# EasyEDA Pro project ProPrj_rk3568B2_2026-10-28.epro, schematic Schematic1, sheets 13 to 19 of 19

## Sheets
13 LPDDR4/4X: Create Date: 2026-03-04; Page Name: LPDDR4/4X; Project Name: rk3568B2; Update Date: 2026-03-04
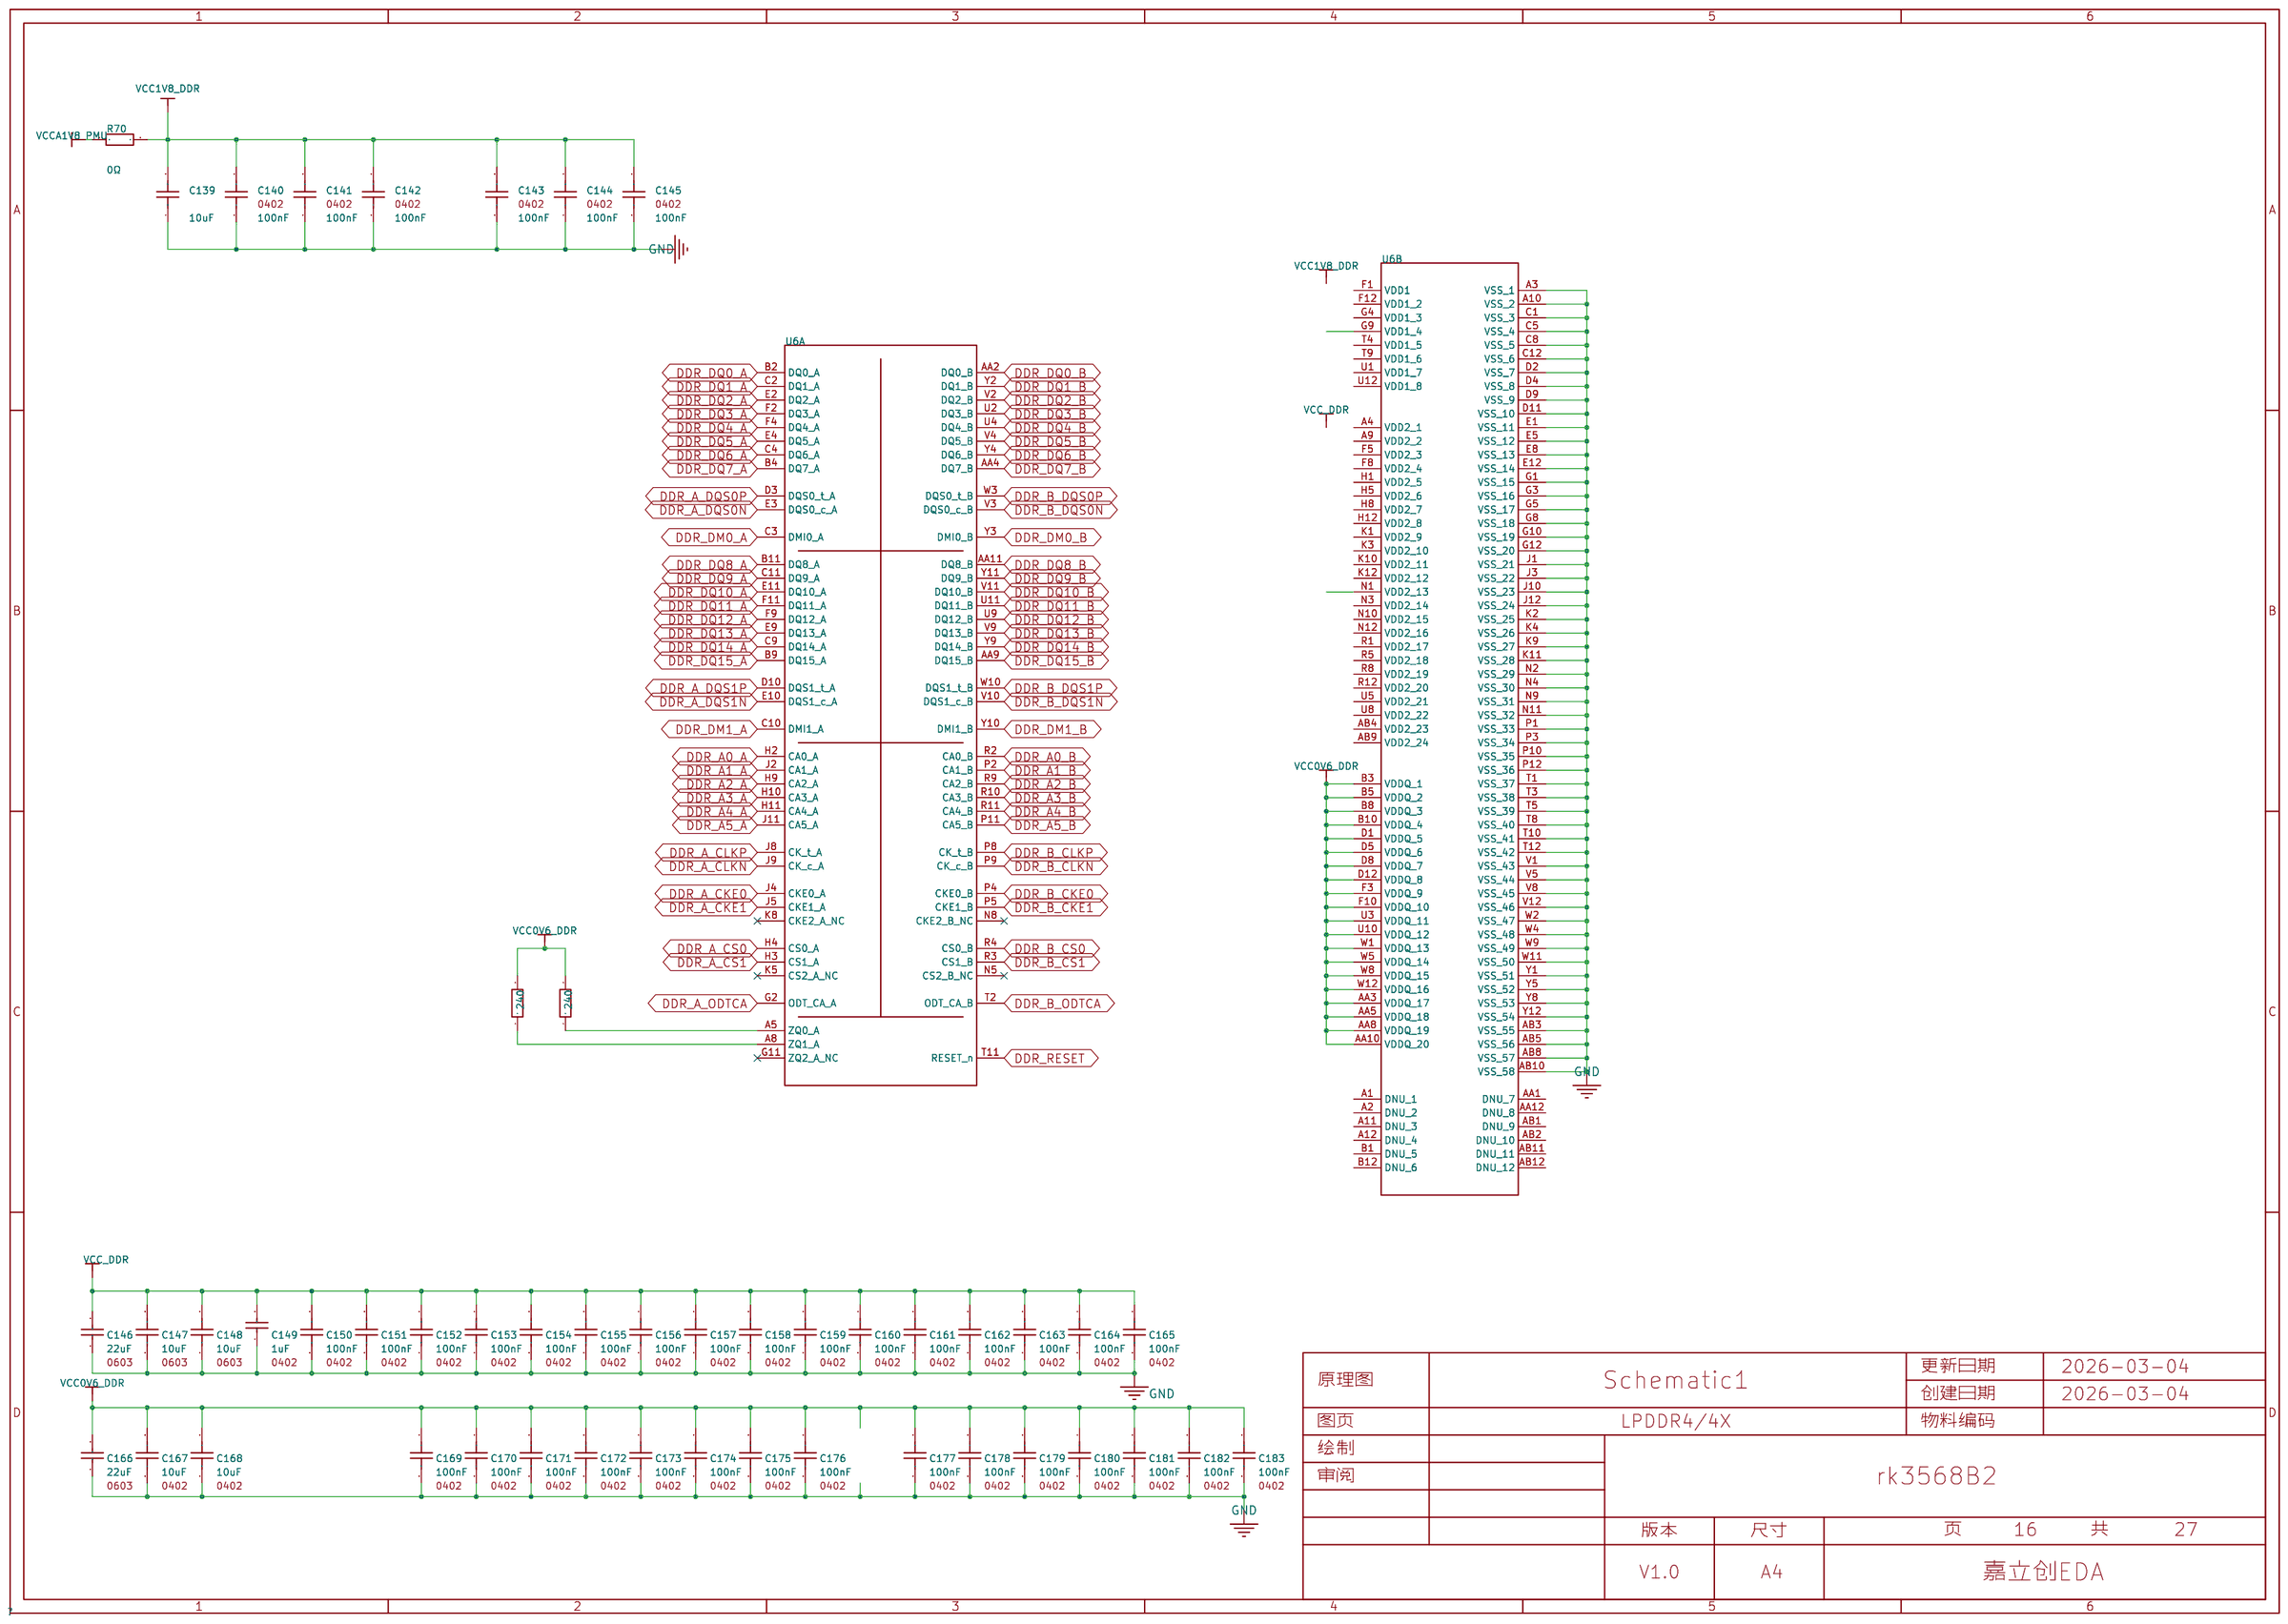
[diagram p12: LPDDR4/4X]
14 RK809-5: Create Date: 2026-03-04; Page Name: RK809-5; Project Name: rk3568B2; Update Date: 2026-03-04
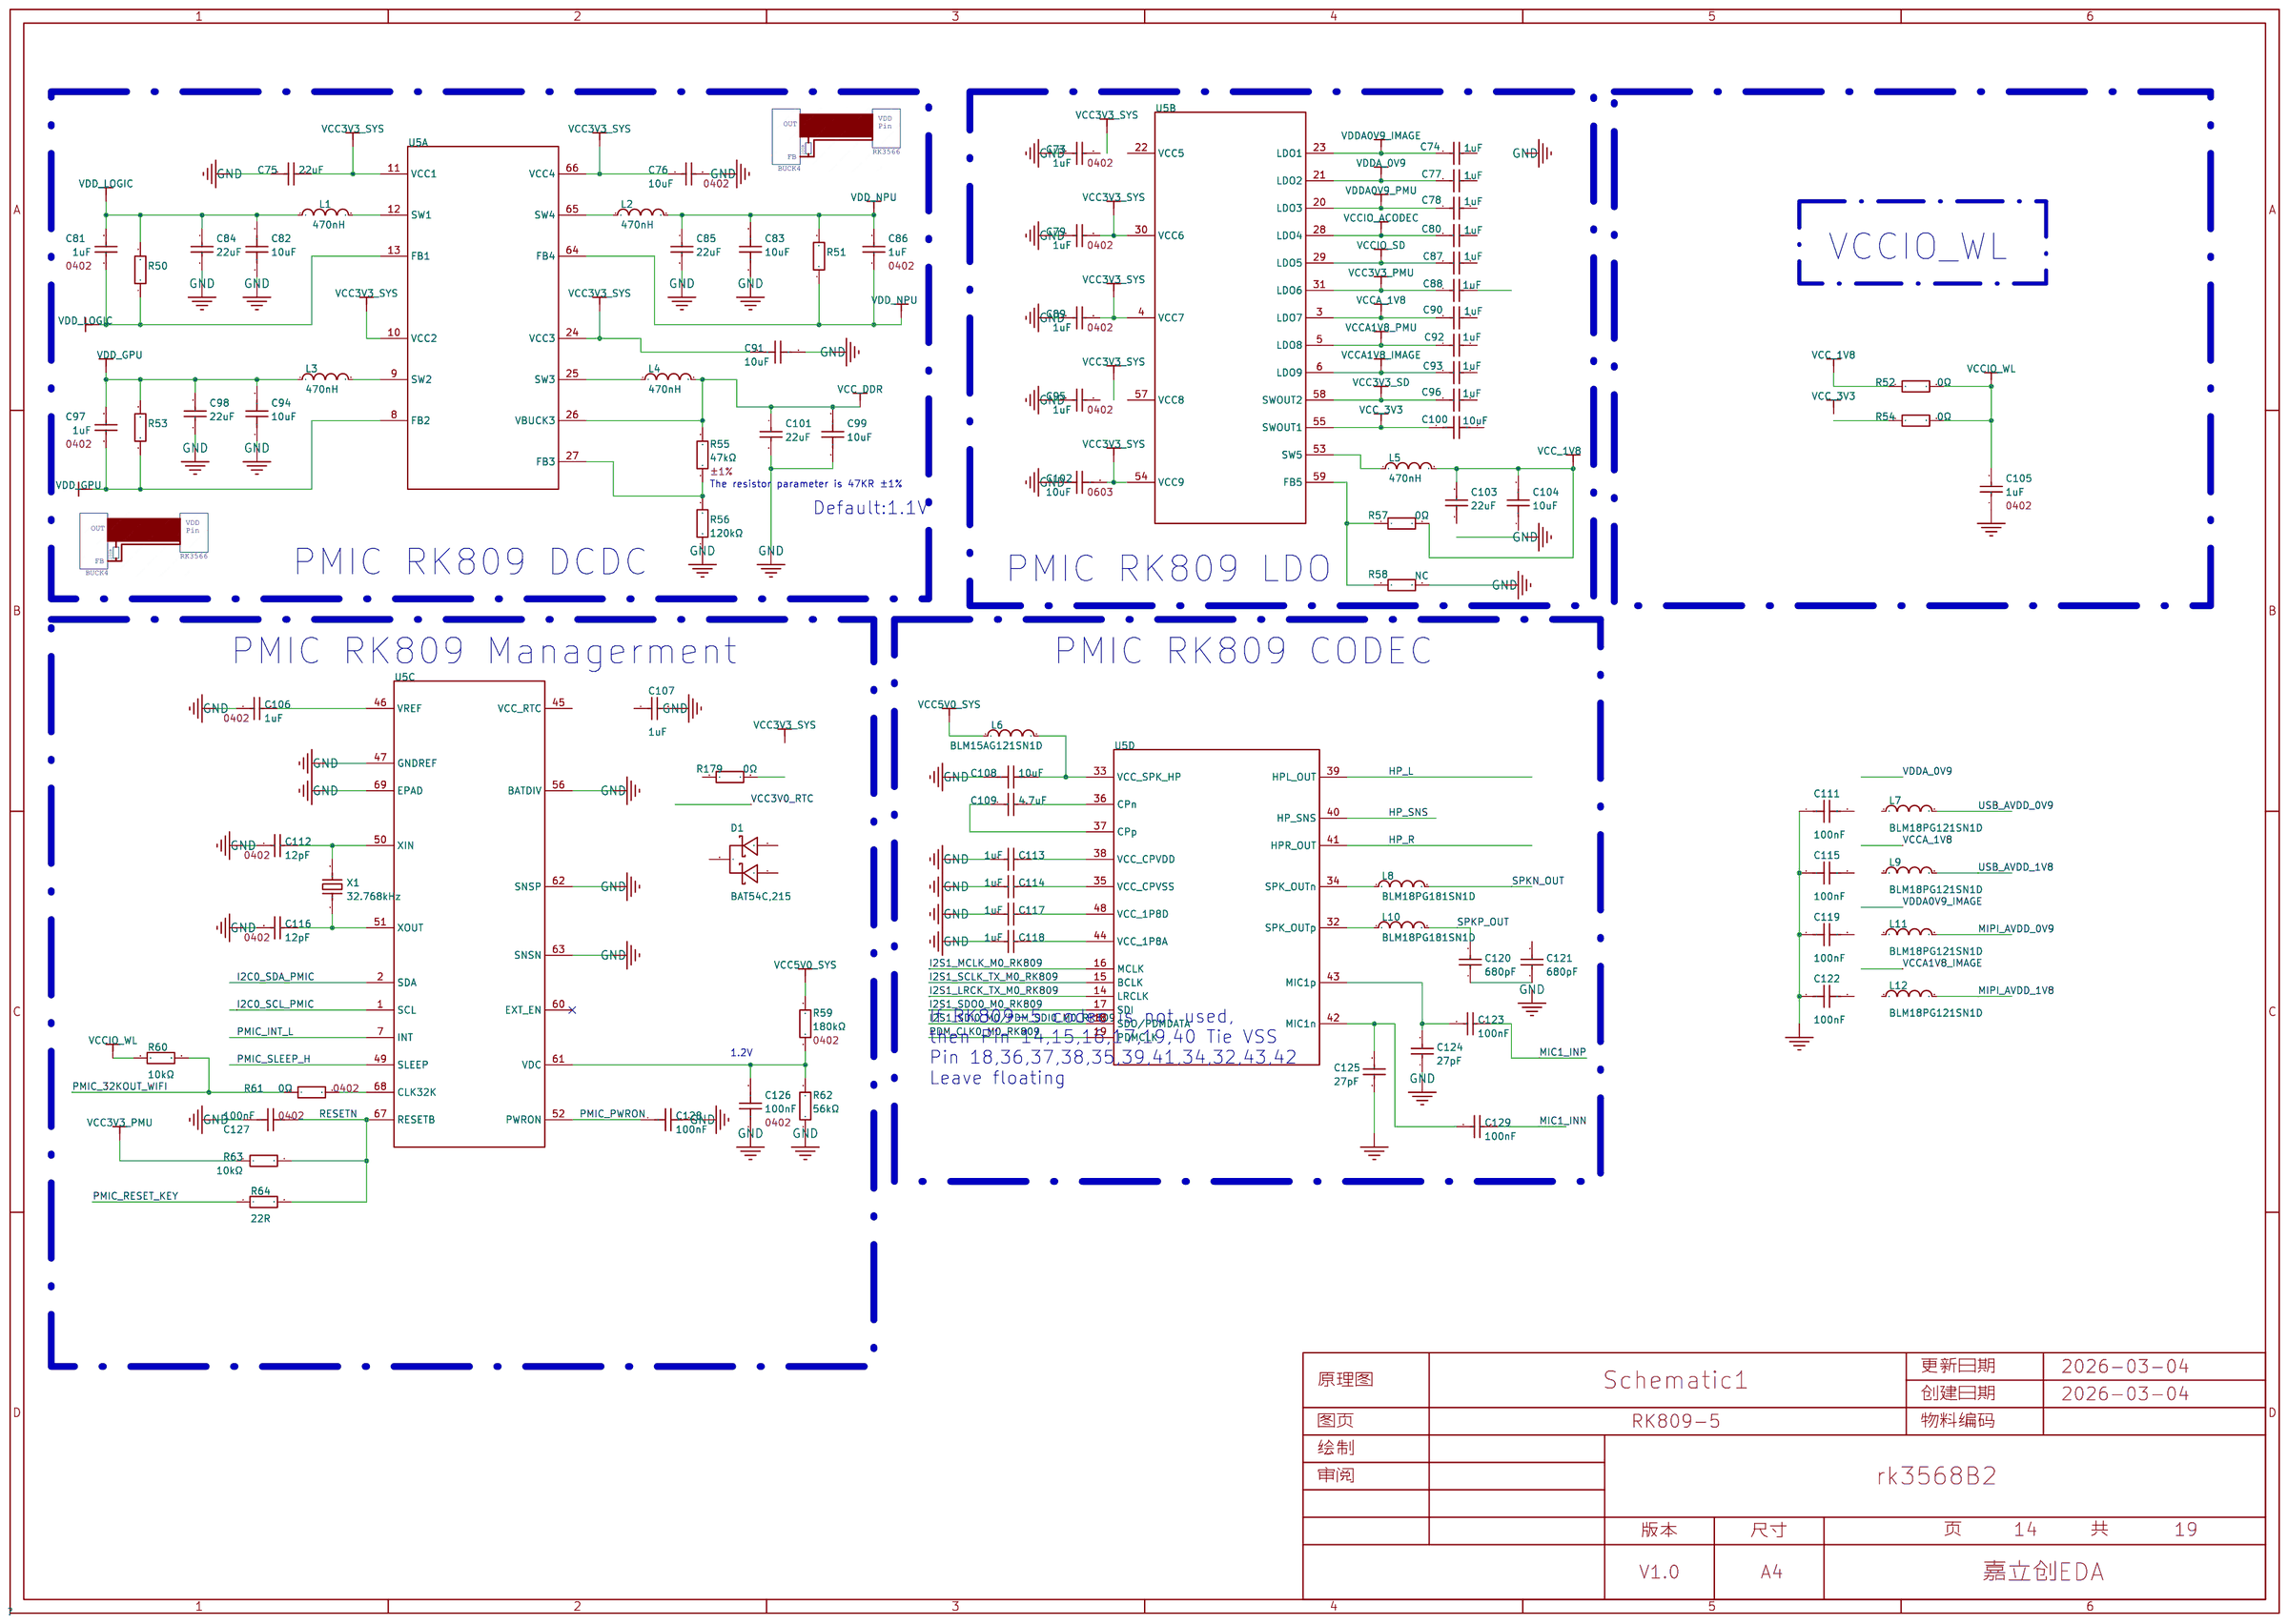
[diagram p13: RK809-5]
15 SOC_FLASH: Board Name: Board1; Page Name: SOC_FLASH; Project Name: RK3568_LPD4X_120P_Core; Update Date: 2025-08-24
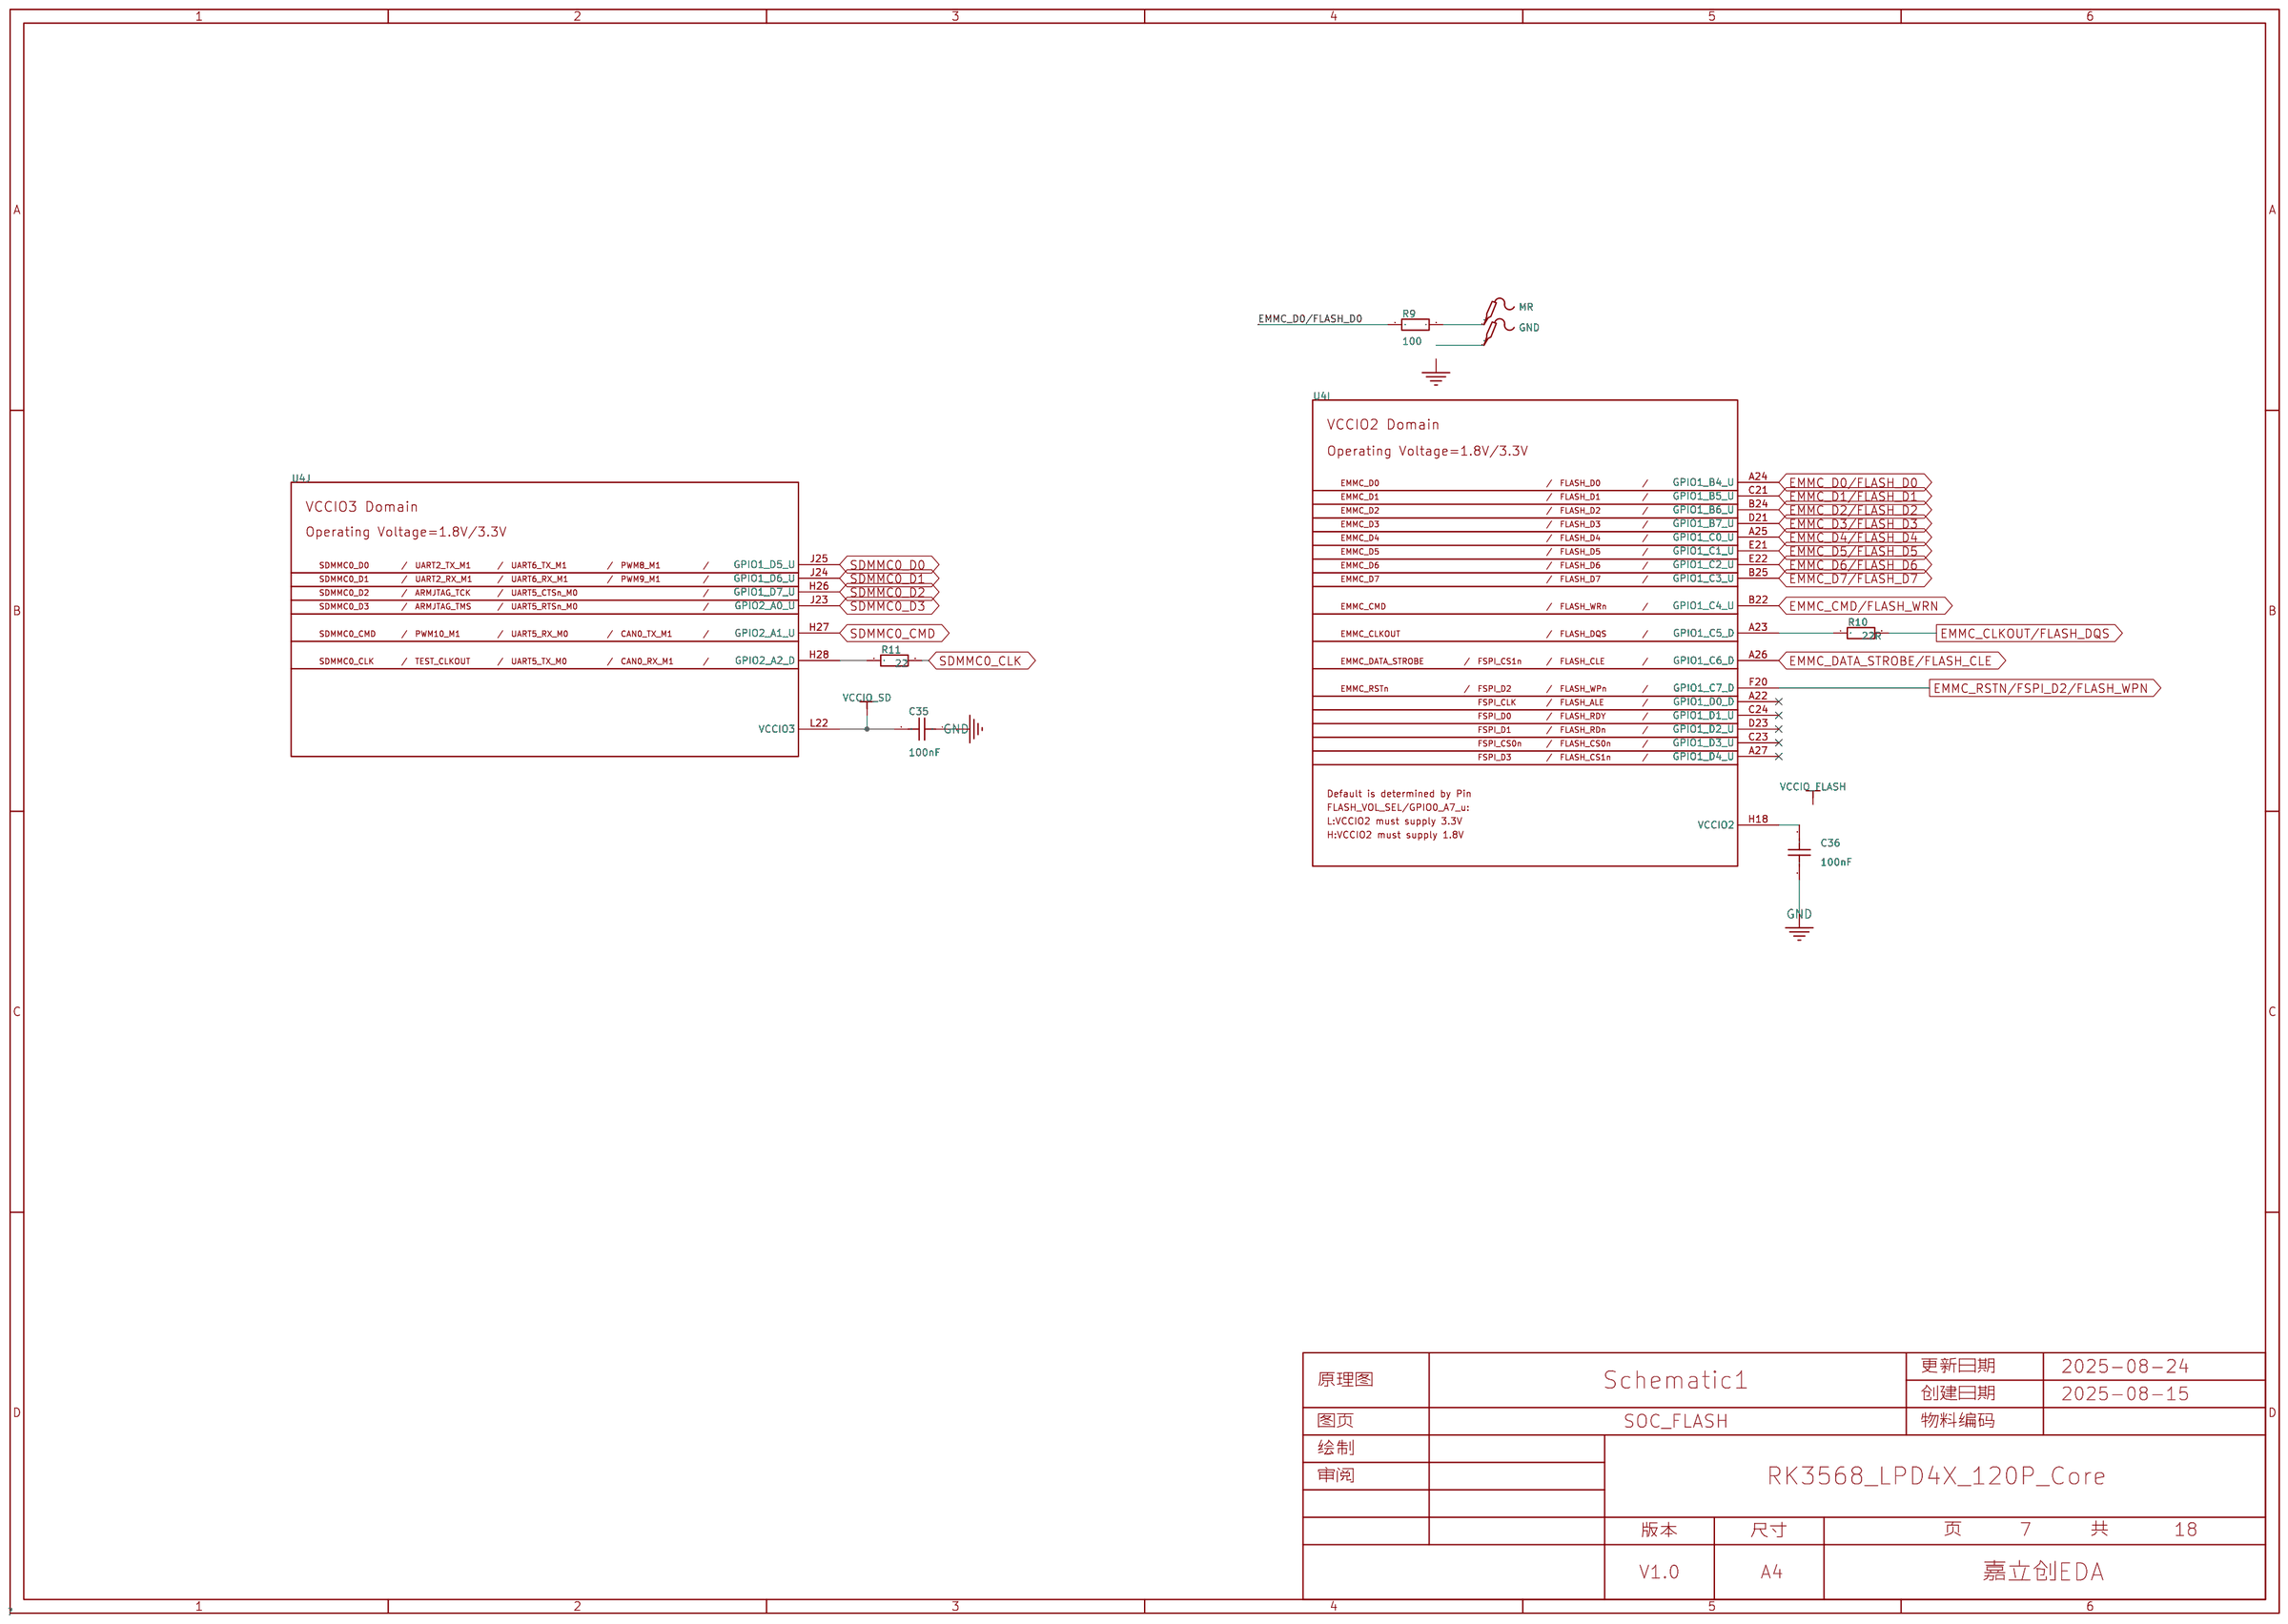
[diagram p14: SOC_FLASH]
16 项目概述: Board Name: Board1; Create Date: 2025-09-28; Page Name: 项目概述; Project Name: Rk3568B路由器
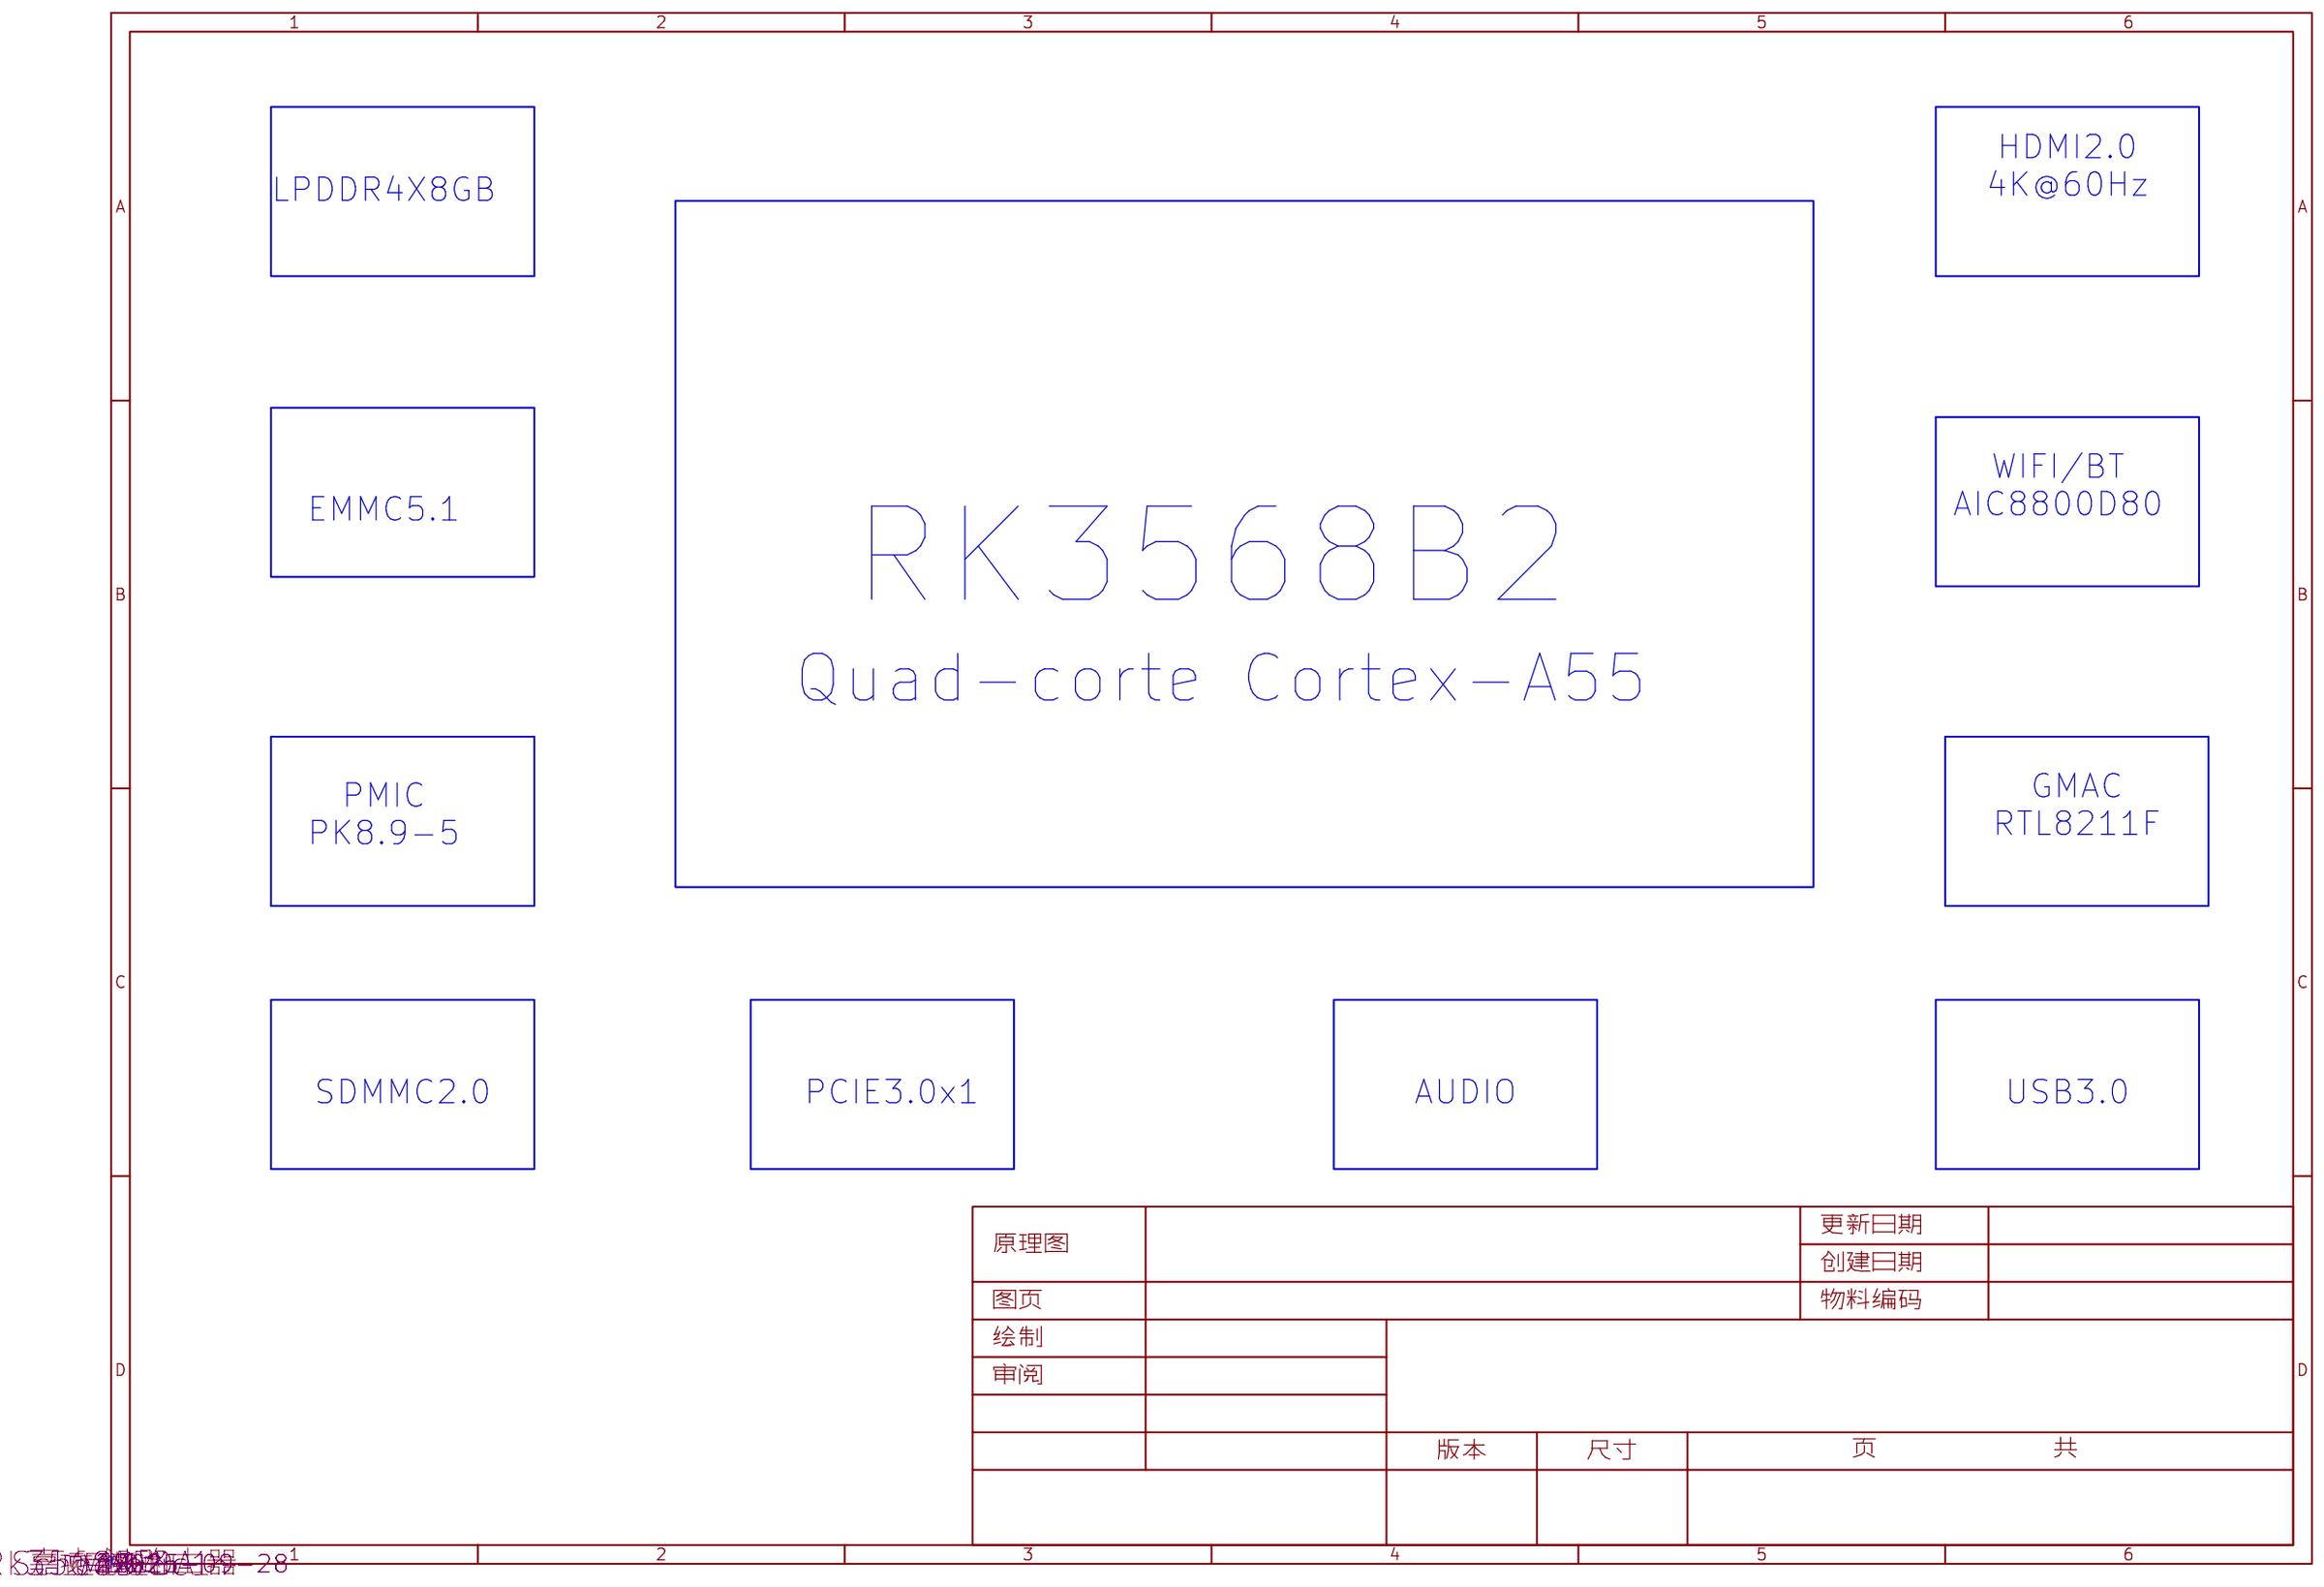
[diagram p15: 项目概述]
17 SOC_IO: Create Date: 2026-03-04; Page Name: SOC_IO; Project Name: rk3568B2; Update Date: 2026-03-04
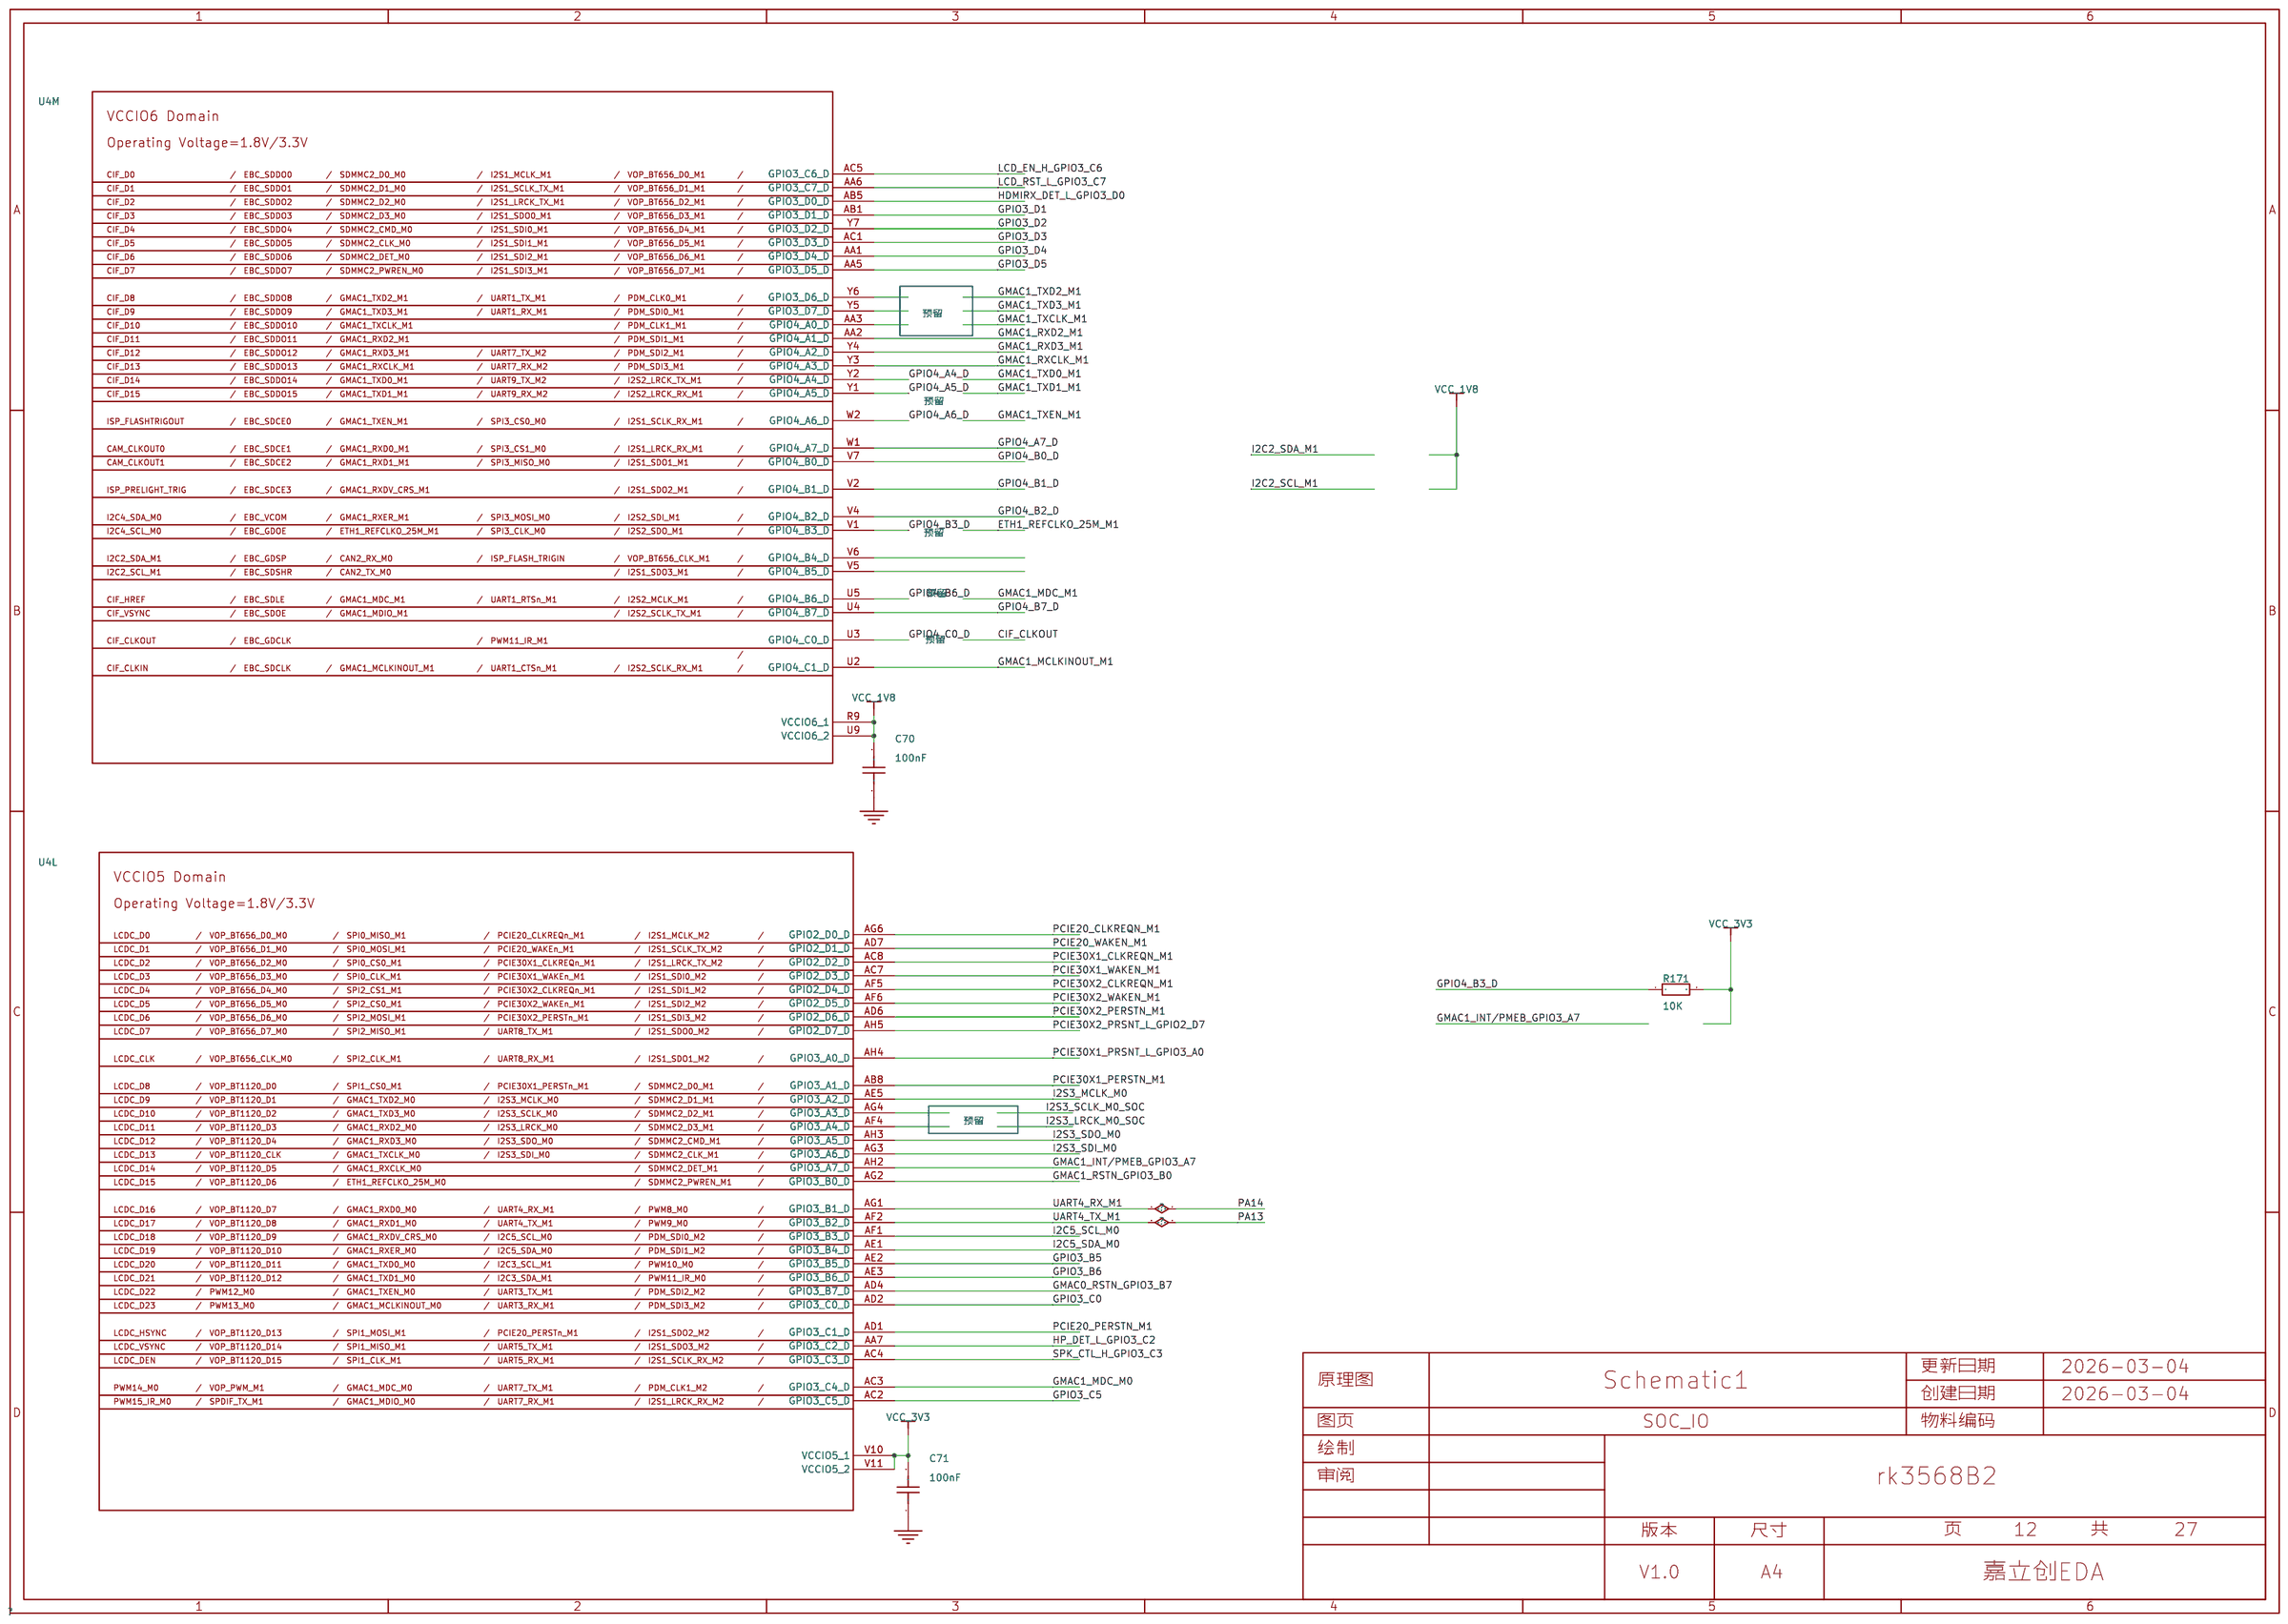
[diagram p16: SOC_IO]
18 P28: Create Date: 2026-03-05; Page Name: P28; Project Name: rk3568B2; Update Date: 2026-03-05
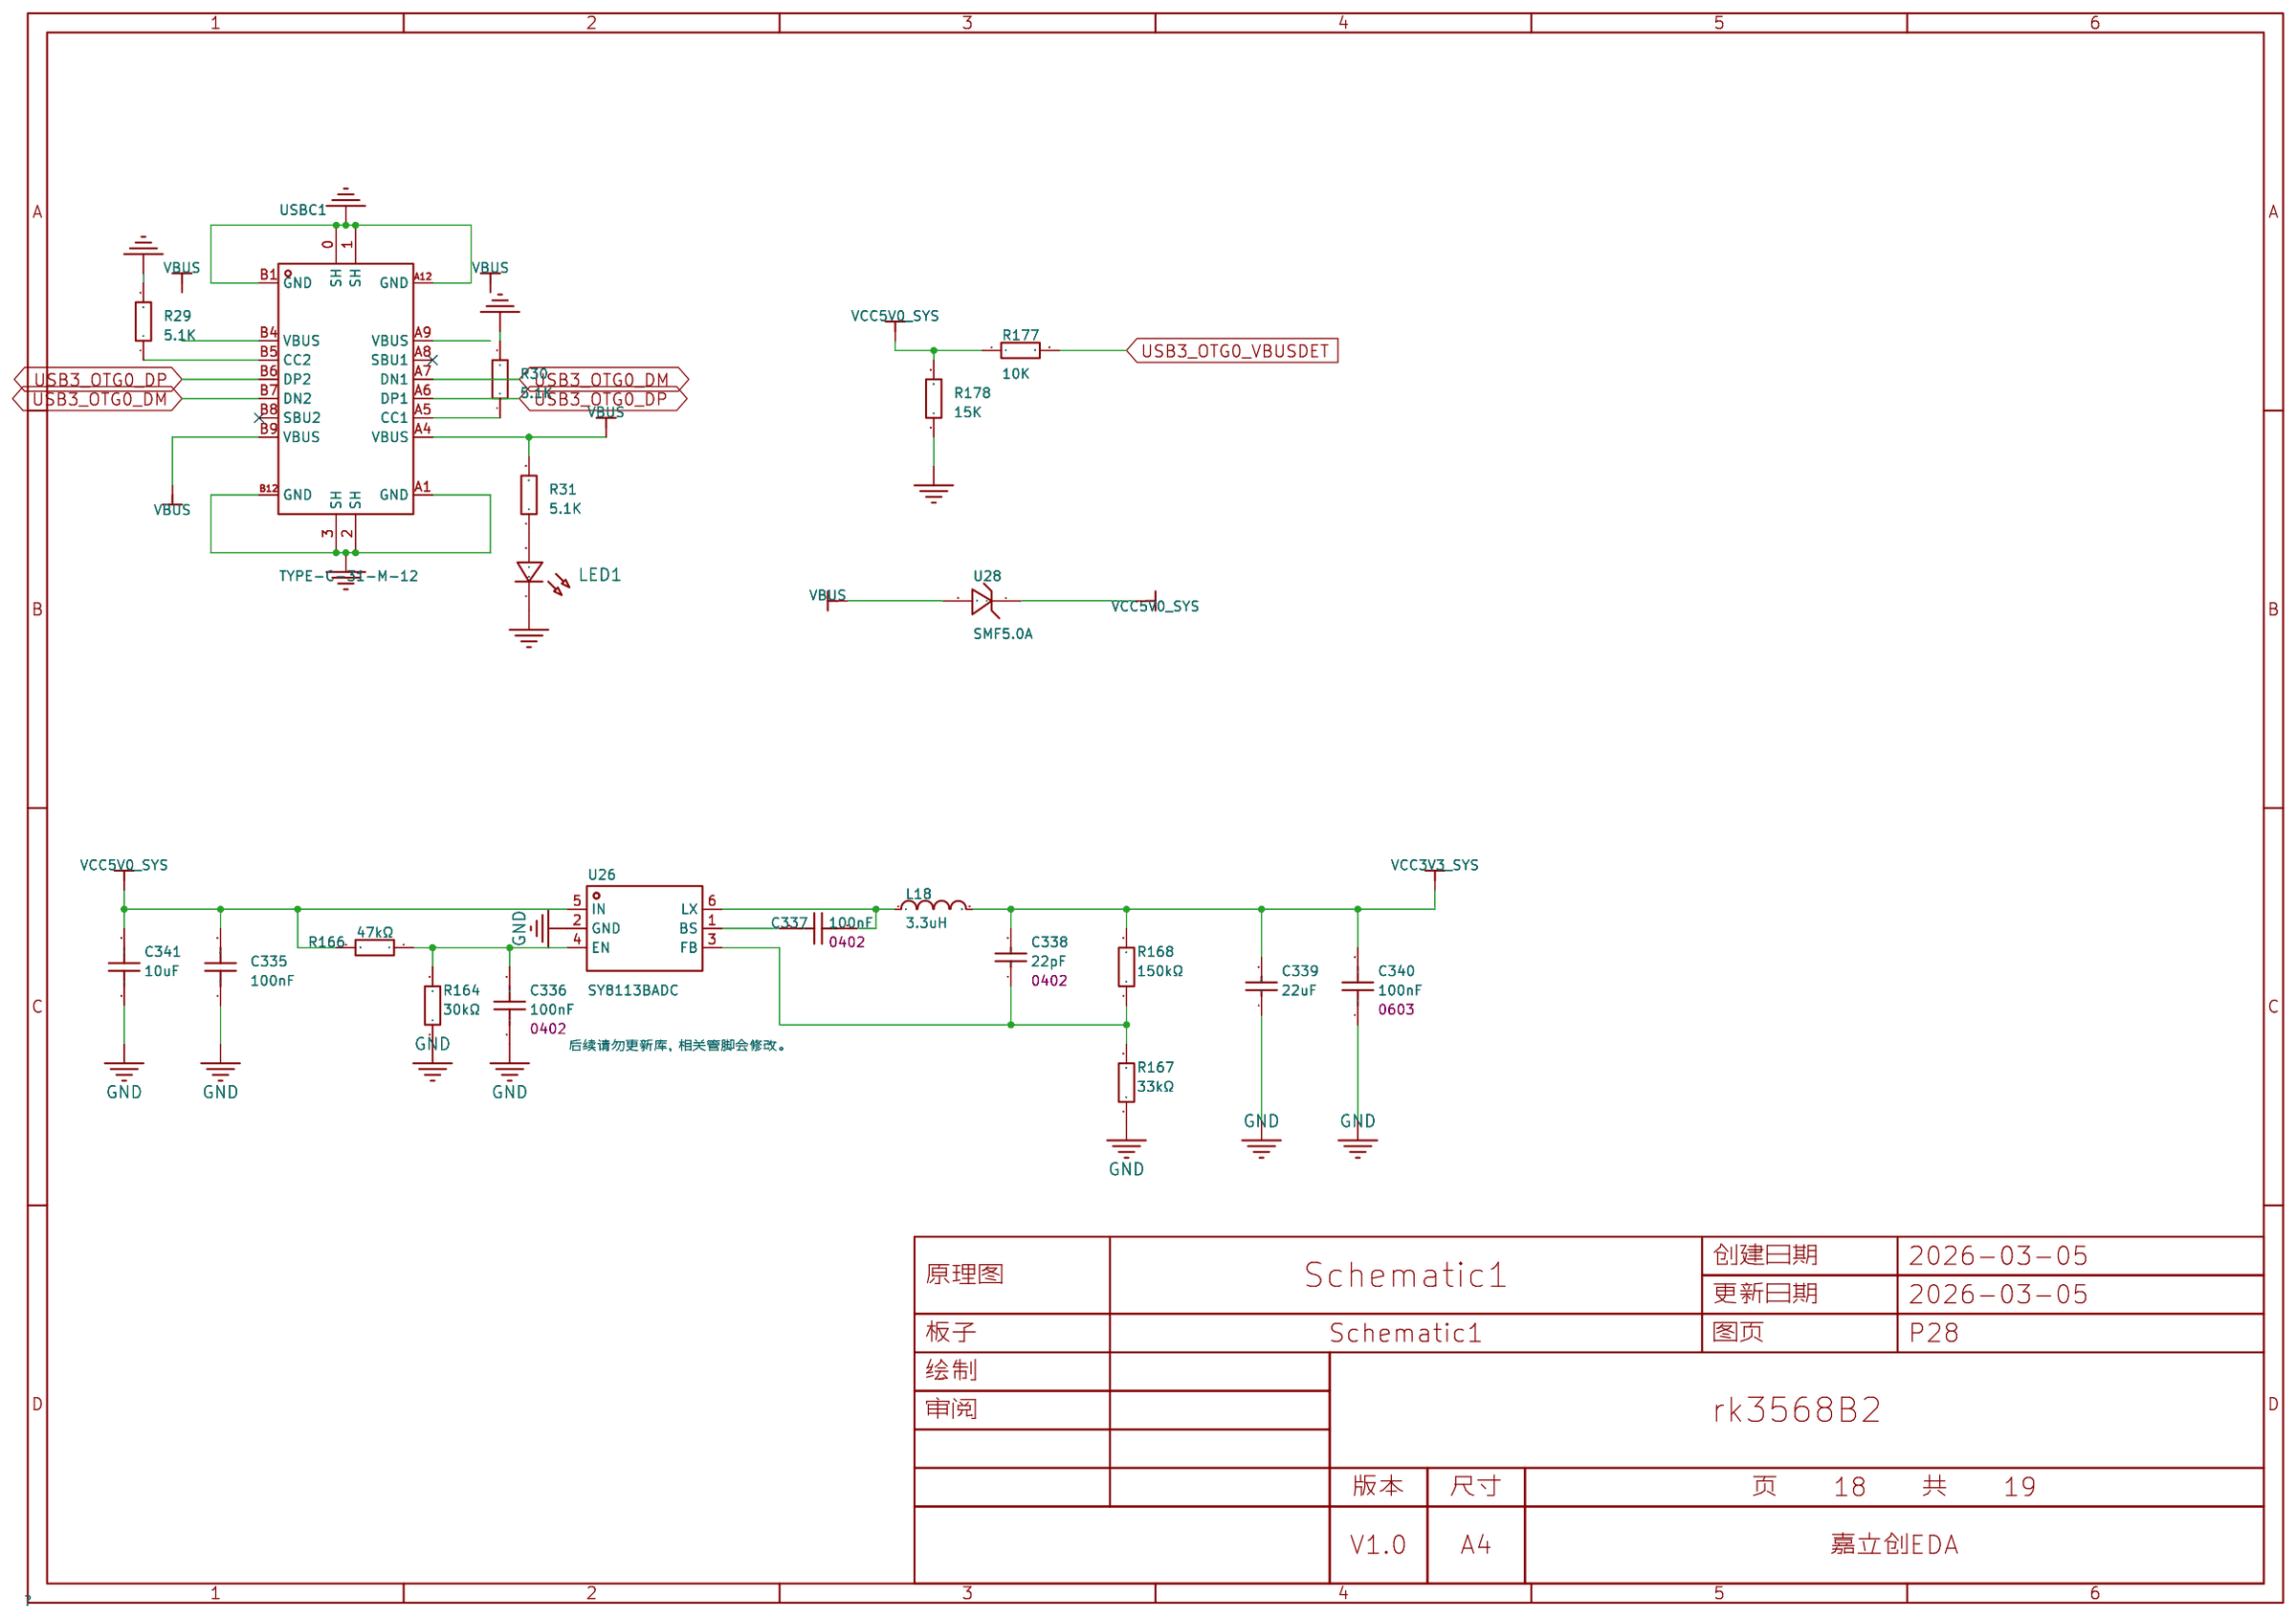
[diagram p17: P28]
19 P29: Create Date: 2026-03-05; Page Name: P29; Project Name: rk3568B2; Update Date: 2026-03-05
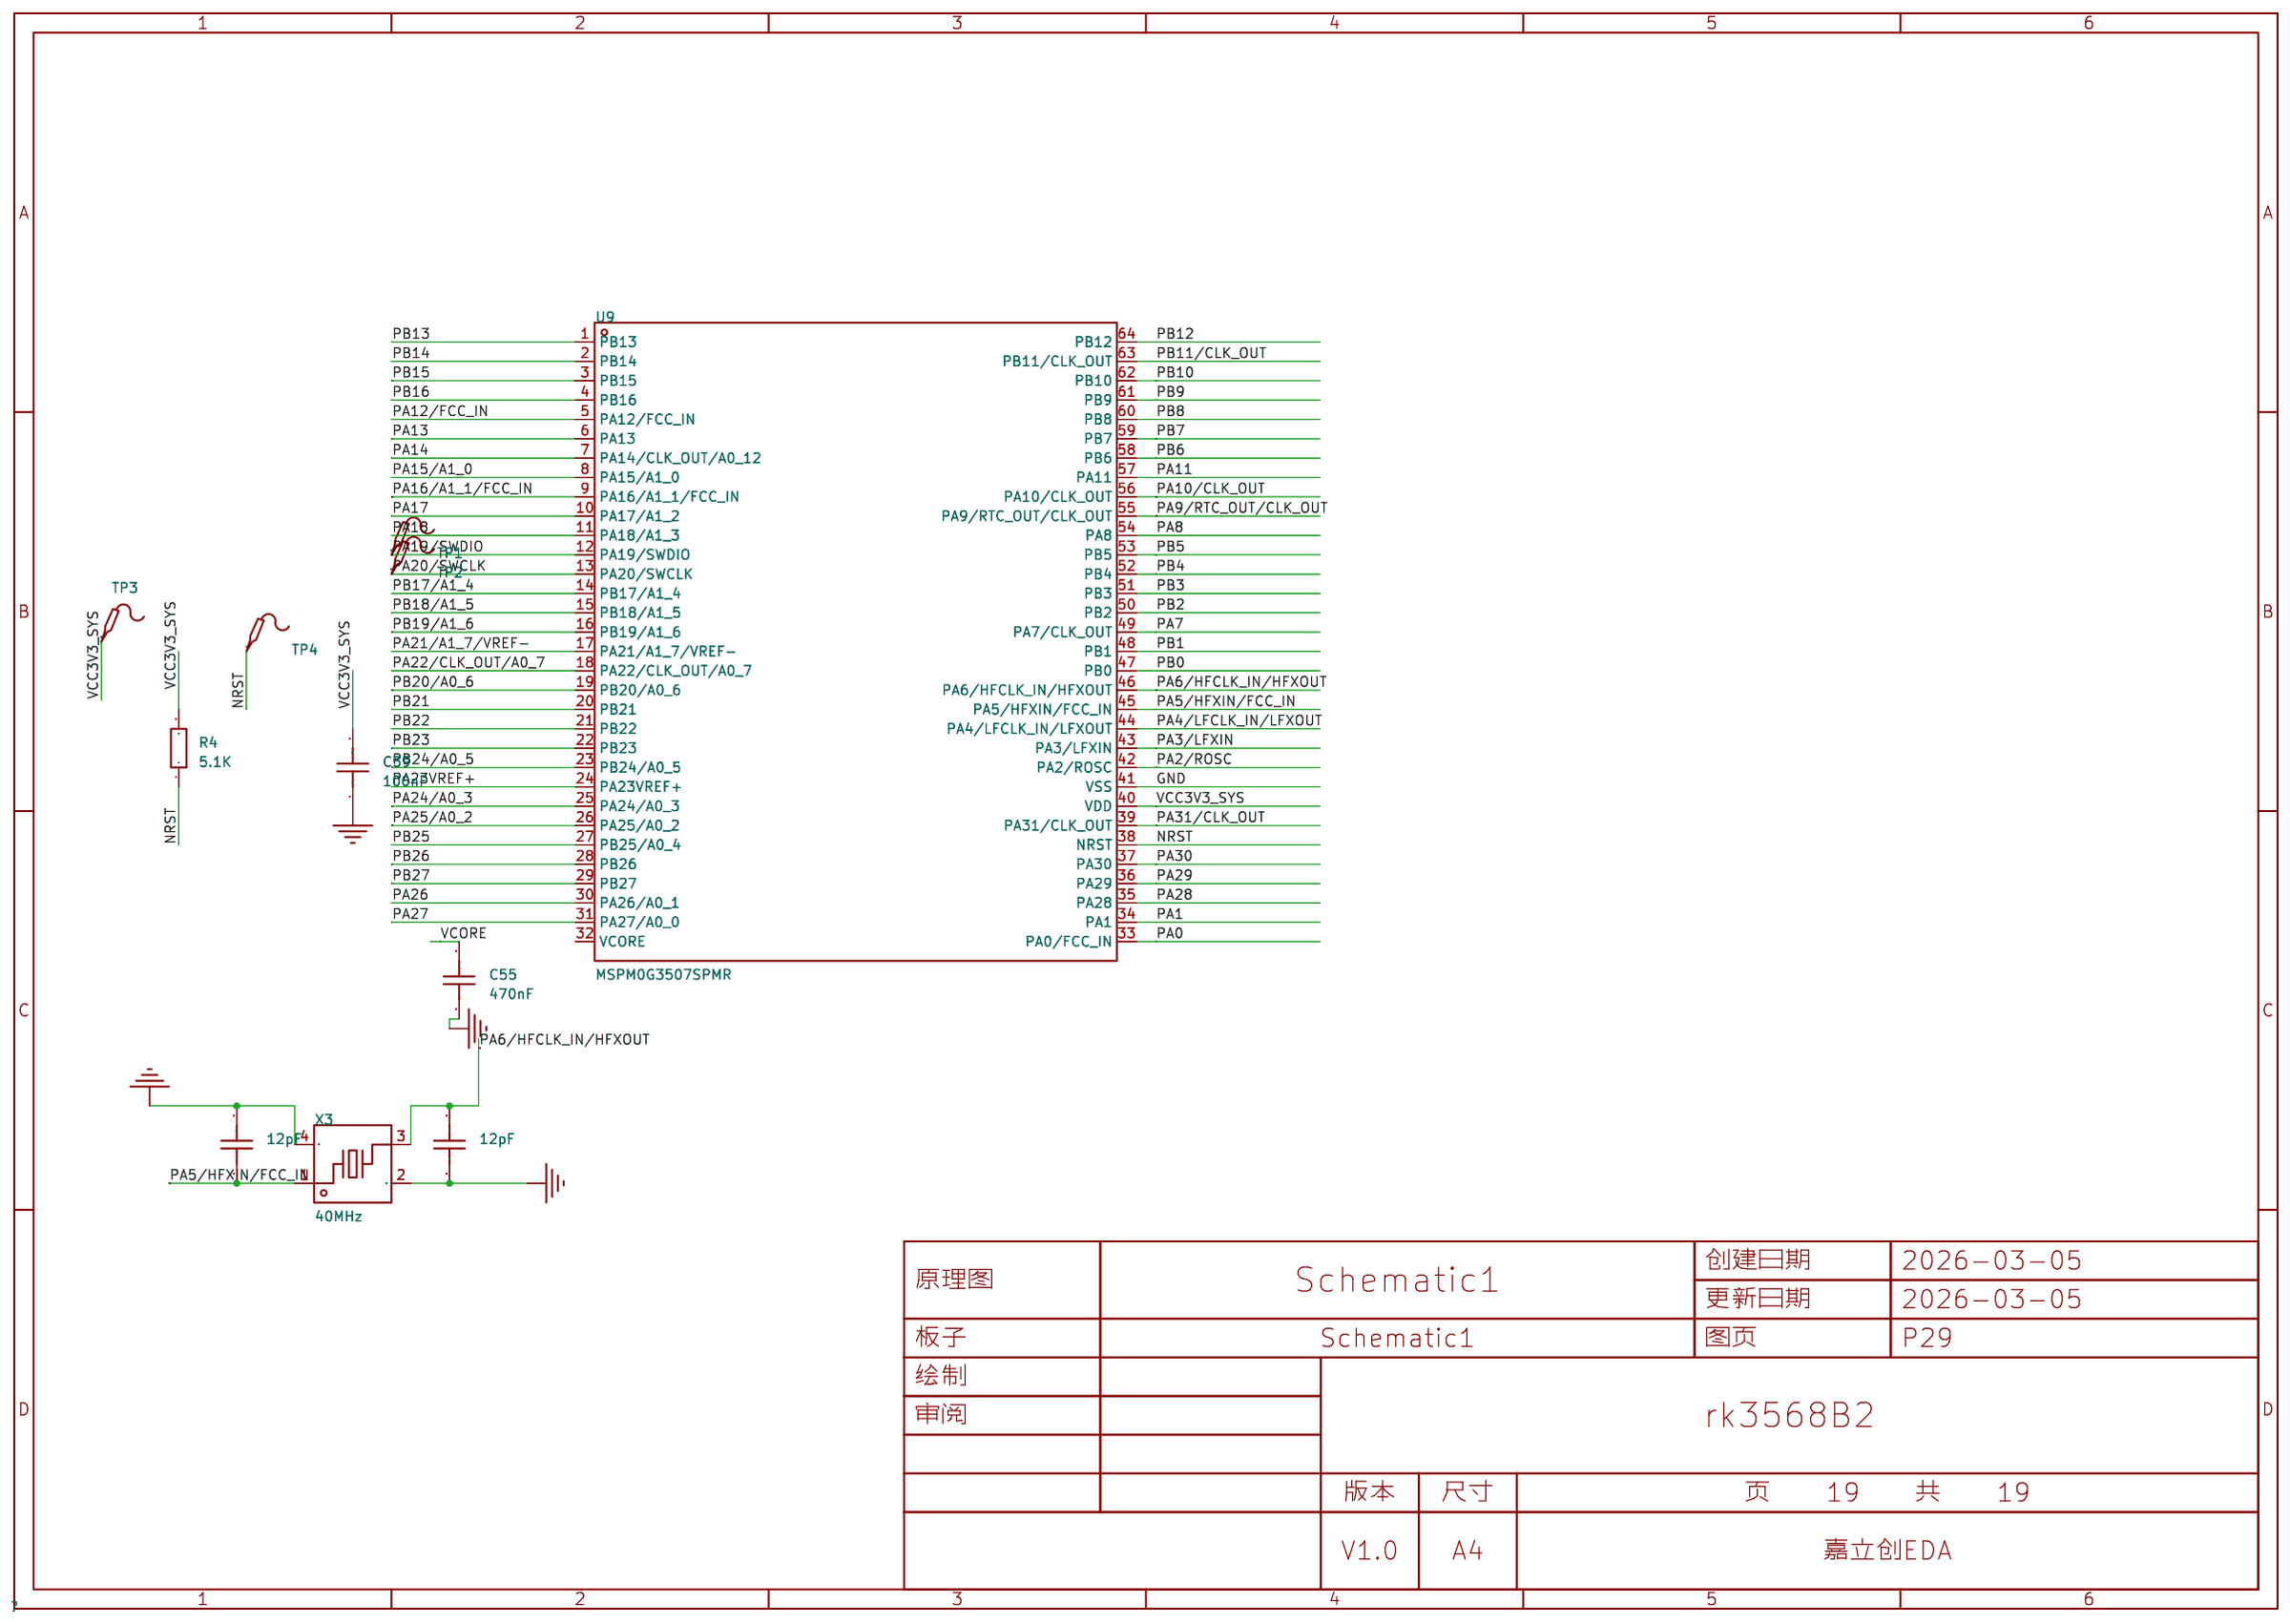
[diagram p18: P29]

## Parts
sheet LPDDR4/4X
C139  10uF  [C0603_3]
C140  100nF  [R0402_2]
C141  100nF  [R0402_2]
C142  100nF  [R0402_2]
C143  100nF  [R0402_2]
C144  100nF  [R0402_2]
C145  100nF  [R0402_2]
C146  22uF  [C0603_2]
C147  10uF  [C0603_3]
C148  10uF  [C0603_3]
C149  1uF  [R0402_2]
C150  100nF  [R0402_2]
C151  100nF  [R0402_2]
C152  100nF  [R0402_2]
C153  100nF  [R0402_2]
C154  100nF  [R0402_2]
C155  100nF  [R0402_2]
C156  100nF  [R0402_2]
C157  100nF  [R0402_2]
C158  100nF  [R0402_2]
C159  100nF  [R0402_2]
C160  100nF  [R0402_2]
C161  100nF  [R0402_2]
C162  100nF  [R0402_2]
C163  100nF  [R0402_2]
C164  100nF  [R0402_2]
C165  100nF  [R0402_2]
C166  22uF  [C0603_2]
C167  10uF  [R0402_2]
C168  10uF  [R0402_2]
C169  100nF  [R0402_2]
C170  100nF  [R0402_2]
C171  100nF  [R0402_2]
C172  100nF  [R0402_2]
C173  100nF  [R0402_2]
C174  100nF  [R0402_2]
C175  100nF  [R0402_2]
C176  100nF  [R0402_2]
C177  100nF  [R0402_2]
C178  100nF  [R0402_2]
C179  100nF  [R0402_2]
C180  100nF  [R0402_2]
C181  100nF  [R0402_2]
C182  100nF  [R0402_2]
C183  100nF  [R0402_2]
R70  0Ω  [R0603_2]
R71  240  [r0402-nsk]
R72  240  [r0402-nsk]
U6  -  [LPDDR4_MrX]  (sections 1,2)
sheet P28
C335  100nF  [C0603]
C336  100nF  [R0402_2]
C337  100nF  [R0402_2]
C338  22pF  [R0402_2]
C339  22uF  [C0603_2]
C340  100nF  [C0603]
C341  10uF  [C0603_3]
L18  3.3uH  [IND-SMD_L4.4-W4.2]
LED1  -  [LED_0603]
R29  5.1K  [R0402_1]
R30  5.1K  [R0402_1]
R31  5.1K  [R0402_1]
R164  30kΩ  [R0402_2]
R166  47kΩ  [R0402_2]
R167  33kΩ  [R0402_2]
R168  150kΩ  [R0402_3]
R177  10K  [R0402_1]
R178  15K  [R0402_1]
U26  SY8113BADC  [TSOT-23-6_L2.9-W1.6-P0.95-LS2.8-BR]
U28  SMF5.0A  [SOD-123FL_L2.8-W1.7-LS3.6-RD]
USBC1  TYPE-C-31-M-12  [USB-C_SMD-TYPE-C-31-M-12]
sheet P29
C4  12pF  [c0402-nsk]
C5  12pF  [c0402-nsk]
C55  470nF  [C0402_1]
C59  100nF  [C0402_1]
R4  5.1K  [R0402_1]
TP1  -  [Test-Point-0.5mm_1]
TP2  -  [Test-Point-0.5mm_1]
TP3  -  [Test-Point-0.5mm_1]
TP4  -  [Test-Point-0.5mm_1]
U9  MSPM0G3507SPMR  [LQFP-64_L10.0-W10.0-P0.50-LS12.0-BL_1]
X3  40MHz  [CRYSTAL-SMD_4P-L3.2-W2.5-BL_1]
sheet RK809-5
C73  1uF  [R0402_2]
C74  1uF  [R0402_2]
C75  22uF  [C0603_2]
C76  10uF  [R0402_2]
C77  1uF  [R0402_2]
C78  1uF  [R0402_2]
C79  1uF  [R0402_2]
C80  1uF  [R0402_2]
C81  1uF  [R0402_2]
C82  10uF  [C0603_3]
C83  10uF  [C0603_3]
C84  22uF  [C0603_2]
C85  22uF  [C0603_2]
C86  1uF  [R0402_2]
C87  1uF  [R0402_2]
C88  1uF  [R0402_2]
C89  1uF  [R0402_2]
C90  1uF  [R0402_2]
C91  10uF  [C0603_3]
C92  1uF  [R0402_2]
C93  1uF  [R0402_2]
C94  10uF  [C0603_3]
C95  1uF  [R0402_2]
C96  1uF  [R0402_2]
C97  1uF  [R0402_2]
C98  22uF  [C0603_2]
C99  10uF  [C0603_3]
C100  10uF  [C0603_3]
C101  22uF  [C0603_2]
C102  10uF  [C0603_3]
C103  22uF  [C0603_2]
C104  10uF  [C0603_3]
C105  1uF  [R0402_2]
C106  1uF  [R0402_2]
C107  1uF  [R0402_2]
C108  10uF  [R0402_2]
C109  4.7uF  [R0402_2]
C111  100nF  [R0402_4]
C112  12pF  [R0402_3]
C113  1uF  [R0402_2]
C114  1uF  [R0402_2]
C115  100nF  [R0402_4]
C116  12pF  [R0402_3]
C117  1uF  [R0402_2]
C118  1uF  [R0402_2]
C119  100nF  [R0402_4]
C120  680pF  [R0402_2]
C121  680pF  [R0402_2]
C122  100nF  [R0402_4]
C123  100nF  [R0402_2]
C124  27pF  [R0402_2]
C125  27pF  [R0402_2]
C126  100nF  [R0402_2]
C127  100nF  [R0402_2]
C128  100nF  [R0402_2]
C129  100nF  [R0402_2]
D1  BAT54C,215  [SOT-23-3_L2.9-W1.6-P1.90-LS2.8-BR]
L1  470nH  [IND-SMD_L2.0-W1.6_MHCHL201610A-1R0M-Q8A]
L2  470nH  [IND-SMD_L2.0-W1.6_MHCHL201610A-1R0M-Q8A]
L3  470nH  [IND-SMD_L2.0-W1.6_MHCHL201610A-1R0M-Q8A]
L4  470nH  [IND-SMD_L2.0-W1.6_MHCHL201610A-1R0M-Q8A]
L5  470nH  [IND-SMD_L2.0-W1.6_MHCHL201610A-1R0M-Q8A]
L6  BLM15AG121SN1D  [L0402]
L7  BLM18PG121SN1D  [L0603_1]
L8  BLM18PG181SN1D  [L0603]
L9  BLM18PG121SN1D  [L0603_1]
L10  BLM18PG181SN1D  [L0603]
L11  BLM18PG121SN1D  [L0603_1]
L12  BLM18PG121SN1D  [L0603_1]
R50  0402WGF1000TCE  [R0402_2]
R51  0402WGF1000TCE  [R0402_2]
R52  0Ω  [R0402_2]
R53  0402WGF1000TCE  [R0402_2]
R54  0Ω  [R0402_2]
R55  47kΩ  [R0402_2]
R56  120kΩ  [R0402_2]
R57  0Ω  [R0402_2]
R58  NC  [R0402_2]
R59  180kΩ  [R0402_2]
R60  10kΩ  [R0402_2]
R61  0Ω  [R0402_2]
R62  56kΩ  [R0402_2]
R63  10kΩ  [R0402_2]
R64  22R  [R0402]
R179  0Ω  [R0402_2]
U5  -  [RK809-5]  (sections 1,2,3,4)
X1  32.768kHz  [CRYSTAL-SMD_L3.2-W1.5-1]
sheet SOC_FLASH
C35  100nF  [C0201]
C36  100nF  [C0201]
GND  -  [Test-Point-0.5mm]
MR  -  [Test-Point-0.5mm]
R9  100  [R0402]
R10  22R  [R0201]
R11  22  [R0201]
sheet SOC_IO
C70  100nF  [C0201]
C71  100nF  [C0201]
R171  10K  [R0402]
sheet SOC_PWR
U4  -  [BGA-636_L19.0-W19.0-P0.65-BL]  (sections A,B,C,D,E,F,G,H,I,J,K,L,M,N,O,P,Q,R,S,T,U,V,W)

## Library data of the parts
C82 C83 C91 C94 C99 C100 C102 C104 C139 C147 C148 C341 = CL10A106KP8NNNC: LCSC Part Name: 10uF ±10% 10V; Supplier Part: C19702; Manufacturer: SAMSUNG(三星); Supplier Footprint: 0603; JLCPCB Part Class: Basic Part; Datasheet: https://atta.szlcsc.com/upload/public/pdf/source/20160103/1457707703378.pdf; Supplier: LCSC; Tolerance: ±10%; Voltage Rated: 10V; Temperature Coefficient: X5R
C126-C128 C140-C145 C150-C165 C169-C183 C336 C337 = CL05B104KB54PNC: LCSC Part Name: 100nF ±10% 50V; Supplier Part: C307331; Manufacturer: SAMSUNG(三星); Supplier Footprint: 0402; JLCPCB Part Class: Basic Part; Datasheet: https://atta.szlcsc.com/upload/public/pdf/source/20181009/C307331_222F7C870FD3EA5F46F538B483443886.pdf; Supplier: LCSC; Tolerance: ±10%; Voltage Rated: 50V; Temperature Coefficient: X7R
C75 C84 C85 C98 C101 C103 C146 C166 C339 = CL10A226MQ8NRNC: LCSC Part Name: 22uF ±20% 6.3V; Supplier Part: C59461; Manufacturer: SAMSUNG(三星); Supplier Footprint: 0603; JLCPCB Part Class: Basic Part; Datasheet: https://atta.szlcsc.com/upload/public/pdf/source/20160218/1457707763339.pdf; Supplier: LCSC; Tolerance: ±20%; Voltage Rated: 6.3V; Temperature Coefficient: X5R
C73 C74 C77-C81 C86-C90 C92 C93 C95-C97 C105-C107 C113 C114 C117 C118 C149 = CL05A105KP5NNNC: LCSC Part Name: 1uF ±10% 10V; Supplier Part: C14445; Manufacturer: SAMSUNG(三星); Supplier Footprint: 0402; JLCPCB Part Class: 扩展库; Datasheet: https://atta.szlcsc.com/upload/public/pdf/source/20160103/1457707670698.pdf; Supplier: LCSC; Tolerance: ±10%; Voltage Rated: 10V; Temperature Coefficient: X5R
C108 C167 C168 = CL05A106MQ5NUNC: LCSC Part Name: 10uF ±20% 6.3V; Supplier Part: C15525; Manufacturer: SAMSUNG(三星); Supplier Footprint: 0402; JLCPCB Part Class: Basic Part; Datasheet: https://atta.szlcsc.com/upload/public/pdf/source/20220823/2B02EE04F8F211D38A52DCB16EB6BEBA.pdf; Supplier: LCSC; Tolerance: ±20%; Voltage Rated: 6.3V; Temperature Coefficient: X5R
R70 = 0603WAF0000T5E: LCSC Part Name: 0Ω ±1% 100mW; Supplier Part: C21189; Manufacturer: UNI-ROYAL(厚声); Supplier Footprint: 0603; JLCPCB Part Class: Basic Part; Datasheet: https://atta.szlcsc.com/upload/public/pdf/source/20200306/C422600_1E6D84923E4A46A82E41ADD87F860B5C.pdf; Supplier: LCSC; Type: 厚膜电阻; Tolerance: ±1%; Power(Watts): 100mW; Overload Voltage (Max): 75V; Operating Temperature Range: -55℃~+155℃
R71 R72 = Res_0402: Supplier Footprint: 0402; Check: false
U6 = LPDDR4: Check: false
C335 = CAP_0603: Supplier Footprint: 0603
C338 = 0402CG220J500NT: LCSC Part Name: 22pF ±5% 50V; Supplier Part: C1555; Manufacturer: FH(风华); Supplier Footprint: 0402; JLCPCB Part Class: Basic Part; Datasheet: https://atta.szlcsc.com/upload/public/pdf/source/20170923/C1555_1506149269156988362.pdf; Supplier: LCSC; Tolerance: ±5%; Voltage Rated: 50V; Temperature Coefficient: C0G
C340 = CC0603KRX7R9BB104: LCSC Part Name: 100nF ±10% 50V; Supplier Part: C14663; Manufacturer: YAGEO(国巨); Supplier Footprint: 0603; JLCPCB Part Class: Basic Part; Datasheet: https://atta.szlcsc.com/upload/public/pdf/source/20180910/C282072_33301C7F631E79921B82A8DAC6BCC5B3.pdf; Supplier: LCSC; Tolerance: ±10%; Voltage Rated: 50V; Temperature Coefficient: X7R
L18 = MWSA0402S-3R3MT: LCSC Part Name: 3.3uH ±20%; Supplier Part: C408336; Manufacturer: Sunlord(顺络); Supplier Footprint: SMD; JLCPCB Part Class: Extended Part; Datasheet: https://atta.szlcsc.com/upload/public/pdf/source/20190729/C408336_17B5BB1DF2845DE8F323BD9CE9EEFEBA.pdf; Supplier: LCSC; Height: 2mm; Rated Current: 3.3A; Width: 4.4mm; Tolerance: ±20%; DC Resistance (DCR): 87mΩ; Length: 4.2mm
LED1 = LED_0603-R: Supplier Footprint: 0603
R4 R29-R31 R177 R178 = Res_403: Supplier Footprint: 0402
R164 = RC0402FR-0730KL: 电阻类型:厚膜电阻;阻值:30kΩ;精度:±1%;功率:62.5mW;; LCSC Part Name: 30kΩ ±1% 62.5mW; Supplier Part: C138008; Manufacturer: YAGEO(国巨); Supplier Footprint: 0402; JLCPCB Part Class: Extended Part; Datasheet: https://atta.szlcsc.com/upload/public/pdf/source/20171107/C138008_15100516356731096935.pdf; Supplier: LCSC; Type: 厚膜电阻; Tolerance: ±1%; Power(Watts): 62.5mW; Temperature Coefficient: ±100ppm/℃; Overload Voltage (Max): 50V; Operating Temperature Range: -55℃~+155℃
R166 = 0402WGF4702TCE: 电阻类型:厚膜电阻;阻值:47kΩ;精度:±1%;功率:62.5mW;; LCSC Part Name: 47kΩ ±1% 62.5mW; Supplier Part: C25792; Manufacturer: UNI-ROYAL(厚声); Supplier Footprint: 0402; JLCPCB Part Class: Basic Part; Datasheet: https://atta.szlcsc.com/upload/public/pdf/source/20200306/C422600_1E6D84923E4A46A82E41ADD87F860B5C.pdf; Supplier: LCSC; Type: 厚膜电阻; Tolerance: ±1%; Power(Watts): 62.5mW; Temperature Coefficient: ±100ppm/℃; Overload Voltage (Max): 50V; Operating Temperature Range: -55℃~+155℃
R167 = 0402WGF5102TCE: 电阻类型:厚膜电阻;阻值:51kΩ;精度:±1%;功率:62.5mW;; LCSC Part Name: 51kΩ ±1% 62.5mW; Supplier Part: C25794; Manufacturer: UNI-ROYAL(厚声); Supplier Footprint: 0402; JLCPCB Part Class: Basic Part; Datasheet: https://atta.szlcsc.com/upload/public/pdf/source/20200306/C422600_1E6D84923E4A46A82E41ADD87F860B5C.pdf; Supplier: LCSC; Type: 厚膜电阻; Tolerance: ±1%; Power(Watts): 62.5mW; Temperature Coefficient: ±100ppm/℃; Overload Voltage (Max): 50V; Operating Temperature Range: -55℃~+155℃
R168 = RC0402FR-07232KL: LCSC Part Name: 232kΩ ±1% 62.5mW; Supplier Part: C309542; Manufacturer: YAGEO(国巨); Supplier Footprint: 0402; JLCPCB Part Class: Extended Part; Datasheet: https://atta.szlcsc.com/upload/public/pdf/source/20181009/C309542_CA3F4488430805647C87B9489F02B718.pdf; Supplier: LCSC; Type: 厚膜电阻; Tolerance: ±1%; Power(Watts): 62.5mW; Temperature Coefficient: ±100ppm/℃; Overload Voltage (Max): 50V; Operating Temperature Range: -55℃~+155℃
U26 = SY8113BADC: LCSC Part Name: 降压型; Supplier Part: C78989; Manufacturer: silergy(矽力杰); Supplier Footprint: TSOT-23-6; JLCPCB Part Class: Extended Part; Datasheet: https://atta.szlcsc.com/upload/public/pdf/source/20161125/1480067827505.pdf; Supplier: LCSC; Function: 降压型
U28 = SMF5.0A: 极性:单向;反向截止电压(Vrwm):5V;钳位电压:9.2V;峰值脉冲电流(Ipp):21.7A;峰值脉冲功率(Ppp):200W;击穿电压:6.4V;; LCSC Part Name: 单向TVS 5V截止 峰值脉冲电流：21.7A; Supplier Part: C2980403; Manufacturer: GOODWORK(固得沃克); Supplier Footprint: SOD-123FL; JLCPCB Part Class: 扩展库; Datasheet: https://item.szlcsc.com/datasheet/SMF5.0A/3402139.html; Supplier: LCSC; Polarity: 单向; Reverse Stand-Off Voltage (Vrwm): 5V; Clamping Voltage: 9.2V; Peak Pulse Current (Ipp): 21.7A; Peak Pulse Power Dissipation (Ppp): 200W; Voltage - Breakdown: 6.4V; Reverse Leakage Current (Ir): 400uA; Number of Channels: 单路; Operating Temperature: -55℃~+150℃@(Tj); Type: TVS
USBC1 = TYPE-C-31-M-12: 连接器类型:Type-C;标准:-;公母:母;安装方式:-;触点数量:16P;端口数量:1;额定电流 - 电源:5A;工作温度范围:-;; LCSC Part Name: Type-C 母; Supplier Part: C165948; Manufacturer: 韩国韩荣; Supplier Footprint: SMD; JLCPCB Part Class: 扩展库; Datasheet: https://atta.szlcsc.com/upload/public/pdf/source/20220525/466408E853115E789EDB0DDC29077C05.pdf; Supplier: LCSC; Connector Type: Type-C; Gender: 母; Number of Contacts: 16P; Number of Ports: 1; Current Rating - Power (Max): 5A
C4 C5 = CL10C120JB8NNNC: LCSC Part Name: 12pF ±5% 50V; Supplier Part: C38523; Manufacturer: SAMSUNG(三星); Supplier Footprint: 0603; JLCPCB Part Class: Basic Part; Datasheet: https://atta.szlcsc.com/upload/public/pdf/source/20160218/1457707763339.pdf; Supplier: LCSC; Tolerance: ±5%; Voltage Rated: 50V; Temperature Coefficient: C0G
C55 C59 = CAP_403: Supplier Footprint: 0402
TP1-TP4 = Test-Point_1: Test Point 测试点
U9 = MSPM0G3507SPMR_C22389960: CPU内核:ARM Cortex-M0+;CPU最大主频:80MHz;CPU位数:32 Bit;; LCSC Part Name: 3.81mm间距线对板和线对线连接器; Supplier Part: C22389960; Manufacturer: TI(德州仪器); Supplier Footprint: LQFP-64(10x10); JLCPCB Part Class: Extended Part; Datasheet: https://www.ti.com.cn/cn/lit/ds/symlink/mspm0g3507.pdf; Supplier: LCSC; CPU Core: ARM Cortex-M0+; CPU Maximum Speed: 80MHz; Core Size: 32 Bit; Program Storage Size: 128KB; Program Memory Type: FLASH; RAM Size: 32KB; Number of I/O: 60; Oscillator Type: 内置+外置; Voltage - Supply: 1.62V~3.6V; Operating Temperature: -40℃~+125℃
X3 = XL2EL89COI-111YLC-40M: 晶振类型:贴片晶振;频率:40MHz;常温频差:±10ppm;负载电容:12pF;频率稳定度:±20ppm;; LCSC Part Name: YSX321SL 40MHZ 4P 3225 12PF ±10PPM -40~85℃ (±20PPM); Supplier Part: C18214314; Manufacturer: YXC(扬兴晶振); Supplier Footprint: SMD3225-4P; JLCPCB Part Class: Extended Part; Datasheet: https://item.szlcsc.com/datasheet/XL2EL89COI-111YLC-40M/19392663.html; Supplier: LCSC; Type: 贴片晶振; Normal temperature Frequency Tolerance: ±10ppm; Load Capacitance: 12pF; Frequency Stability: ±20ppm; Operating Temperature: -40℃~+85℃
C76 = CL05A106MQ5NUNC: LCSC Part Name: 10uF ±20% 6.3V; Supplier Part: C15525; Manufacturer: SAMSUNG(三星); Supplier Footprint: 0402; JLCPCB Part Class: 基础库; Datasheet: https://atta.szlcsc.com/upload/public/pdf/source/20220823/2B02EE04F8F211D38A52DCB16EB6BEBA.pdf; Supplier: LCSC; Tolerance: ±20%; Voltage Rated: 6.3V; Temperature Coefficient: X5R
C109 = CL05A475MQ5NRNC: LCSC Part Name: 4.7uF ±20% 6.3V; Supplier Part: C307423; Manufacturer: SAMSUNG(三星); Supplier Footprint: 0402; JLCPCB Part Class: Extended Part; Datasheet: https://atta.szlcsc.com/upload/public/pdf/source/20181010/C307423_0E0C4E35F3A09F81C2E5C84E00499E42.pdf; Supplier: LCSC; Tolerance: ±20%; Voltage Rated: 6.3V; Temperature Coefficient: X5R
C111 C115 C119 C122 = CAP_0402: Supplier Footprint: 0402
C112 C116 = 0402CG120J500NT: LCSC Part Name: 12pF ±5% 50V; Supplier Part: C1547; Manufacturer: FH(风华); Supplier Footprint: 0402; JLCPCB Part Class: Basic Part; Datasheet: https://atta.szlcsc.com/upload/public/pdf/source/20200305/C486355_26A10D38EF8C2A5C37091D0039909270.pdf; Supplier: LCSC; Tolerance: ±5%; Voltage Rated: 50V; Temperature Coefficient: C0G
C120 C121 = 0402B681K500NT: LCSC Part Name: 680pF ±10% 50V; Supplier Part: C1541; Manufacturer: FH(风华); Supplier Footprint: 0402; JLCPCB Part Class: Extended Part; Datasheet: https://atta.szlcsc.com/upload/public/pdf/source/20170923/C1541_1506149263051988348.pdf; Supplier: LCSC; Tolerance: ±10%; Voltage Rated: 50V; Temperature Coefficient: X7R
C123 C129 = CL05B104KO5NNNC: LCSC Part Name: 100nF ±10% 16V; Supplier Part: C1525; Manufacturer: SAMSUNG(三星); Supplier Footprint: 0402; JLCPCB Part Class: 基础库; Datasheet: https://atta.szlcsc.com/upload/public/pdf/source/20160103/1457707674891.pdf; Supplier: LCSC; Tolerance: ±10%; Voltage Rated: 16V; Temperature Coefficient: X7R
C124 C125 = 0402CG270J500NT: LCSC Part Name: 27pF ±5% 50V; Supplier Part: C1557; Manufacturer: FH(风华); Supplier Footprint: 0402; JLCPCB Part Class: Basic Part; Datasheet: https://atta.szlcsc.com/upload/public/pdf/source/20170923/C1557_1506149270123988364.pdf; Supplier: LCSC; Tolerance: ±5%; Voltage Rated: 50V; Temperature Coefficient: C0G
D1 = BAT54C,215: LCSC Part Name: 电压:30V 电流:200mA; Supplier Part: C37704; Manufacturer: Nexperia(安世); Supplier Footprint: SOT-23; JLCPCB Part Class: 扩展库; Datasheet: https://item.szlcsc.com/datasheet/BAT54C%252C215/38684.html; Supplier: LCSC; Diode Configuration: 1对共阴极; Voltage - Forward(Vf@If): 800mV@100mA; Voltage - DC Reverse(Vr): 30V; Current - Rectified: 200mA; Reverse Leakage Current (Ir): 2uA@25V; Non-Repetitive Peak Forward Surge Current: 600mA
L1-L5 = MCS20FC-R47MHC: LCSC Part Name: 470nH ±20% 4.05A 23mΩ; Supplier Part: C375941; Manufacturer: PSA(信昌电陶); Supplier Footprint: SMD; JLCPCB Part Class: 扩展库; Datasheet: https://atta.szlcsc.com/upload/public/pdf/source/20190312/C375941_0FA6931C341ECE1823B3912EFF81D587.pdf; Supplier: LCSC; Tolerance: ±20%; Rated Current: 4.05A; DC Resistance (DCR): 23mΩ
L6 = BLM15AG121SN1D: LCSC Part Name: 120Ω@100MHz ±25%; Supplier Part: C85812; Manufacturer: muRata(村田); Supplier Footprint: 0402; JLCPCB Part Class: Extended Part; Datasheet: https://atta.szlcsc.com/upload/public/pdf/source/20180326/C85812_709B7ABD18A92BCC8FFBD7A231EEE264.pdf; Supplier: LCSC; Impedance @ Frequency: 120Ω@100MHz; Tolerance: ±25%; DC Resistance: 250mΩ; Current Rating: 500mA; Circuits: 1
L7 L9 L11 L12 = BLM18PG121SN1D: LCSC Part Name: 单路 0603磁珠 阻抗120Ω@100MHz; Supplier Part: C14709; Manufacturer: muRata(村田); Supplier Footprint: 0603; JLCPCB Part Class: 基础库; Datasheet: https://atta.szlcsc.com/upload/public/pdf/source/20130704/1457706621422.pdf; Supplier: LCSC; Impedance @ Frequency: 120Ω@100MHz; Tolerance: ±25%; DC Resistance: 50mΩ; Current Rating: 2A; Circuits: 1
L8 L10 = BLM18PG181SN1D: LCSC Part Name: 180Ω@100MHz ±25%; Supplier Part: C82850; Manufacturer: muRata(村田); Supplier Footprint: 0603; JLCPCB Part Class: Extended Part; Datasheet: https://atta.szlcsc.com/upload/public/pdf/source/20180326/C82850_BC876320DC99E3923AFD377E2F9C4AED.pdf; Supplier: LCSC; Impedance @ Frequency: 180Ω@100MHz; Tolerance: ±25%; DC Resistance: 90mΩ; Current Rating: 1.5A; Circuits: 1
R50 R51 R53 = 0402WGF1000TCE: Supplier: LCSC; Supplier Part: C25076; Supplier Footprint: 0402; JLCPCB Part Class: Basic Part; LCSC Part Name: 100Ω(1000) ±1% 编带; Datasheet: https://atta.szlcsc.com/upload/public/pdf/source/20170920/C25076_1505901197574982707.pdf; Manufacturer: UNI-ROYAL(厚声)
R52 R54 R57 R61 R179 = ERJ2GE0R00X: LCSC Part Name: 0Ω 100mW; Supplier Part: C242160; Manufacturer: PANASONIC(松下); Supplier Footprint: 0402; JLCPCB Part Class: 扩展库; Datasheet: https://atta.szlcsc.com/upload/public/pdf/source/20181106/C242160_CA6E41971DE5A1DCD79442F3CF334CD6.pdf; Supplier: LCSC; Power(Watts): 100mW; Temperature Coefficient: -100ppm/℃~+600ppm/℃; Operating Temperature Range: -55℃~+155℃
R55 = 0402WGF4702TCE: LCSC Part Name: 47kΩ ±1% 62.5mW; Supplier Part: C25792; Manufacturer: UNI-ROYAL(厚声); Supplier Footprint: 0402; JLCPCB Part Class: Basic Part; Datasheet: https://atta.szlcsc.com/upload/public/pdf/source/20200306/C422600_1E6D84923E4A46A82E41ADD87F860B5C.pdf; Supplier: LCSC; Type: 厚膜电阻; Tolerance: ±1%; Power(Watts): 62.5mW; Temperature Coefficient: ±100ppm/℃; Overload Voltage (Max): 50V; Operating Temperature Range: -55℃~+155℃
R56 = 0402WGF1203TCE: LCSC Part Name: 120kΩ ±1% 62.5mW; Supplier Part: C25750; Manufacturer: UNI-ROYAL(厚声); Supplier Footprint: 0402; JLCPCB Part Class: Basic Part; Datasheet: https://atta.szlcsc.com/upload/public/pdf/source/20200306/C422600_1E6D84923E4A46A82E41ADD87F860B5C.pdf; Supplier: LCSC; Type: 厚膜电阻; Tolerance: ±1%; Power(Watts): 62.5mW; Temperature Coefficient: ±100ppm/℃; Overload Voltage (Max): 50V; Operating Temperature Range: -55℃~+155℃
R58 = ERJ2GE0R00X: LCSC Part Name: 0Ω 100mW; Manufacturer: PANASONIC(松下); Supplier Footprint: 0402; JLCPCB Part Class: 扩展库; Datasheet: https://atta.szlcsc.com/upload/public/pdf/source/20181106/C242160_CA6E41971DE5A1DCD79442F3CF334CD6.pdf; Supplier: LCSC; Power(Watts): 100mW; Temperature Coefficient: -100ppm/℃~+600ppm/℃; Operating Temperature Range: -55℃~+155℃
R59 = RC0402FR-07180KL: LCSC Part Name: 180kΩ ±1% 62.5mW; Supplier Part: C138046; Manufacturer: YAGEO(国巨); Supplier Footprint: 0402; JLCPCB Part Class: Extended Part; Datasheet: https://atta.szlcsc.com/upload/public/pdf/source/20171107/C138046_15100516638711096969.pdf; Supplier: LCSC; Type: 厚膜电阻; Tolerance: ±1%; Power(Watts): 62.5mW; Temperature Coefficient: ±100ppm/℃; Overload Voltage (Max): 50V; Operating Temperature Range: -55℃~+155℃
R60 R63 = CRCW040210K0FKED: LCSC Part Name: 10kΩ ±1% 63mW; Supplier Part: C71617; Manufacturer: VISHAY(威世); Supplier Footprint: 0402; JLCPCB Part Class: 扩展库; Datasheet: https://atta.szlcsc.com/upload/public/pdf/source/20180224/C71617_15194370300791364062.pdf; Supplier: LCSC; Type: 厚膜电阻; Tolerance: ±1%; Power(Watts): 63mW; Temperature Coefficient: ±100ppm/K; Overload Voltage (Max): 50V; Operating Temperature Range: -55℃~+155℃
R62 = 0402WGF5602TCE: LCSC Part Name: 56KΩ ±1%; Supplier Part: C25796; Manufacturer: UNI-ROYAL(厚声); Supplier Footprint: 0402; JLCPCB Part Class: Basic Part; Datasheet: https://atta.szlcsc.com/upload/public/pdf/source/20170920/C25796_1505901547482983369.pdf; Supplier: LCSC; Tolerance: ±1%; Power(Watts): 1/16W; Temperature Coefficient: ±100ppm/℃; Overload Voltage (Max): 50V; Operating Temperature Range: -55℃~+155℃
R9 R64 R171 = Res_0402: Supplier Footprint: 0402
U5 = RK809-5
X1 = XKXGI-SUA-32.768K: LCSC Part Name: 32.768kHz ±20ppm 12.5pF YST310S; Supplier Part: C5213671; Manufacturer: YXC(扬兴晶振); Supplier Footprint: SMD3215-2P; JLCPCB Part Class: Extended Part; Datasheet: https://atta.szlcsc.com/upload/public/pdf/source/20221026/C961783E7D3E186CA8CEB40DFC46D85F.pdf; Supplier: LCSC; Crystal Type: 贴片无源晶振; Frequency Tolerance: ±20ppm; Load Capacitance: 12.5pF; Operating Temperature: -40℃~+85℃; Equivalent Series Resistance (ESR): 70kΩ
C35 C36 C70 C71 = GRM035R60J475ME15D: LCSC Part Name: 4.7uF ±20% 6.3V; Supplier Part: C335103; Manufacturer: muRata(村田); Supplier Footprint: 0201; JLCPCB Part Class: Extended Part; Datasheet: https://item.szlcsc.com/datasheet/GRM035R60J475ME15D/313624.html; Supplier: LCSC; Tolerance: ±20%; Voltage Rating: 6.3V; Temperature Coefficient: X5R
GND MR = Test-Point
R10 R11 = Res_0201: Supplier Footprint: 0201
U4 = RK3568

## Nets
GND: C4.2 C5.1 C35.1 C36.1 C55.1 C59.1 C70.1 C71.1 C73.1 C74.2 C75.1 C76.2 C77.2 C78.2 C79.1 C80.2 C82.1 C83.1 C84.2 C85.2 C87.2 C88.2 C89.1 C90.2 C91.1 C92.2 C93.2 C94.1 C95.1 C96.2 C98.2 C99.1 C100.2 C101.2 C102.1 C103.2 C104.1 C105.1 C106.1 C107.2 C108.1 C111.1 C112.1 C113.1 C114.1 C115.1 C116.2 C117.1 C118.1 C119.1 C120.1 C121.1 C122.1 C124.1 C125.1 C126.1 C127.1 C128.2 C139.1 C140.1 C141.1 C142.1 C143.1 C144.1 C145.1 C146.1 C147.1 C148.1 C149.1 C150.2 C151.2 C152.2 C153.2 C154.2 C155.2 C156.2 C157.2 C158.2 C159.2 C160.2 C161.2 C162.2 C163.2 C164.2 C165.2 C166.1 C167.1 C168.1 C169.2 C170.2 C171.2 C172.2 C173.2 C174.2 C175.2 C176.2 C177.2 C178.2 C179.2 C180.2 C181.2 C182.2 C183.2 C335.1 C336.1 C339.1 C340.1 C341.1 GND.1 LED1.1(C) R29.2 R30.2 R56.1 R58.2 R62.1 R164.1 R167.1 R178.1 U5.47(GNDREF) U5.56(BATDIV) U5.62(SNSP) U5.63(SNSN) U5.69(EPAD) U6.A3(VSS_1) U6.A10(VSS_2) U6.AB3(VSS_55) U6.AB5(VSS_56) U6.AB8(VSS_57) U6.AB10(VSS_58) U6.C1(VSS_3) U6.C5(VSS_4) U6.C8(VSS_5) U6.C12(VSS_6) U6.D2(VSS_7) U6.D4(VSS_8) U6.D9(VSS_9) U6.D11(VSS_10) U6.E1(VSS_11) U6.E5(VSS_12) U6.E8(VSS_13) U6.E12(VSS_14) U6.G1(VSS_15) U6.G3(VSS_16) U6.G5(VSS_17) U6.G8(VSS_18) U6.G10(VSS_19) U6.G12(VSS_20) U6.J1(VSS_21) U6.J3(VSS_22) U6.J10(VSS_23) U6.J12(VSS_24) U6.K2(VSS_25) U6.K4(VSS_26) U6.K9(VSS_27) U6.K11(VSS_28) U6.N2(VSS_29) U6.N4(VSS_30) U6.N9(VSS_31) U6.N11(VSS_32) U6.P1(VSS_33) U6.P3(VSS_34) U6.P10(VSS_35) U6.P12(VSS_36) U6.T1(VSS_37) U6.T3(VSS_38) U6.T5(VSS_39) U6.T8(VSS_40) U6.T10(VSS_41) U6.T12(VSS_42) U6.V1(VSS_43) U6.V5(VSS_44) U6.V8(VSS_45) U6.V12(VSS_46) U6.W2(VSS_47) U6.W4(VSS_48) U6.W9(VSS_49) U6.W11(VSS_50) U6.Y1(VSS_51) U6.Y5(VSS_52) U6.Y8(VSS_53) U6.Y12(VSS_54) U9.41(VSS) U26.2(GND) USBC1.0(SH) USBC1.1(SH) USBC1.2(SH) USBC1.3(SH) USBC1.A1(GND) USBC1.A12(GND) USBC1.B1(GND) USBC1.B12(GND) X3.2(GND) X3.4(GND) ; also on sheet 2 3 4 5 6 7 8 9 10 11 12
VBUS: R31.2 U28.2 USBC1.A4(VBUS) USBC1.A9(VBUS) USBC1.B4(VBUS) USBC1.B9(VBUS)
VCC0V6_DDR: C166.2 C167.2 C168.2 C169.1 C170.1 C171.1 C172.1 C173.1 C174.1 C175.1 C176.1 C177.1 C178.1 C179.1 C180.1 C181.1 C182.1 C183.1 R71.2 R72.2 U6.AA3(VDDQ_17) U6.AA5(VDDQ_18) U6.AA8(VDDQ_19) U6.AA10(VDDQ_20) U6.B3(VDDQ_1) U6.B5(VDDQ_2) U6.B8(VDDQ_3) U6.B10(VDDQ_4) U6.D1(VDDQ_5) U6.D5(VDDQ_6) U6.D8(VDDQ_7) U6.D12(VDDQ_8) U6.F3(VDDQ_9) U6.F10(VDDQ_10) U6.U3(VDDQ_11) U6.U10(VDDQ_12) U6.W1(VDDQ_13) U6.W5(VDDQ_14) U6.W8(VDDQ_15) U6.W12(VDDQ_16) ; also on sheet 7 12
VCC1V8_DDR: C139.2 C140.2 C141.2 C142.2 C143.2 C144.2 C145.2 R70.1 U6.F1(VDD1) U6.F12(VDD1_2) U6.G4(VDD1_3) U6.G9(VDD1_4) U6.T4(VDD1_5) U6.T9(VDD1_6) U6.U1(VDD1_7) U6.U12(VDD1_8) ; also on sheet 12
VCC3V0_RTC: C107.1 R179.1 U5.45(VCC_RTC)
VCC3V3_PMU: C88.1 R63.1 U5.31(LDO6) ; also on sheet 8 12
VCC3V3_SD: C96.1 U5.58(SWOUT2) ; also on sheet 2
VCC3V3_SYS: C59.2 C73.2 C75.2 C76.1 C79.2 C89.2 C91.2 C95.2 C102.2 C338.2 C339.2 C340.2 L18.2 R4.2 R168.2 R179.2 TP3.1 U5.4(VCC7) U5.10(VCC2) U5.11(VCC1) U5.22(VCC5) U5.24(VCC3) U5.30(VCC6) U5.54(VCC9) U5.57(VCC8) U5.66(VCC4) U9.40(VDD) ; also on sheet 11 12
VCC5V0_SYS: C335.2 C341.2 L6.1 R59.2 R166.2 R177.1 R178.2 U26.5(IN) U28.1 ; also on sheet 11
VCC_1V8: C70.2 C103.1 C104.2 L5.2 R52.1 R57.2 U4.R9(VCCIO6_1) U4.U9(VCCIO6_2) ; also on sheet 6 12
VCC_3V3: C71.2 C100.1 R54.1 R171.2 U4.V10(VCCIO5_1) U4.V11(VCCIO5_2) U5.55(SWOUT1) ; also on sheet 6 9
VCC_DDR: C99.2 C101.1 C146.2 C147.2 C148.2 C149.2 C150.1 C151.1 C152.1 C153.1 C154.1 C155.1 C156.1 C157.1 C158.1 C159.1 C160.1 C161.1 C162.1 C163.1 C164.1 C165.1 L4.2 R55.1 U5.26(VBUCK3) U6.A4(VDD2_1) U6.A9(VDD2_2) U6.AB4(VDD2_23) U6.AB9(VDD2_24) U6.F5(VDD2_3) U6.F8(VDD2_4) U6.H1(VDD2_5) U6.H5(VDD2_6) U6.H8(VDD2_7) U6.H12(VDD2_8) U6.K1(VDD2_9) U6.K3(VDD2_10) U6.K10(VDD2_11) U6.K12(VDD2_12) U6.N1(VDD2_13) U6.N3(VDD2_14) U6.N10(VDD2_15) U6.N12(VDD2_16) U6.R1(VDD2_17) U6.R5(VDD2_18) U6.R8(VDD2_19) U6.R12(VDD2_20) U6.U5(VDD2_21) U6.U8(VDD2_22) ; also on sheet 7
VCCA1V8_IMAGE: C93.1 C122.2 L12.1 U5.6(LDO9) ; also on sheet 3
VCCA1V8_PMU: C92.1 R70.2 U5.5(LDO8) ; also on sheet 8
VCCA_1V8: C90.1 C115.2 L9.1 U5.3(LDO7) ; also on sheet 6 8 9
VCCIO_ACODEC: C80.1 U5.28(LDO4) ; also on sheet 5
VCCIO_FLASH: C36.2 U4.H18(VCCIO2) ; also on sheet 2 12
VCCIO_SD: C35.2 C87.1 U4.L22(VCCIO3) U5.29(LDO5)
VCCIO_WL: C105.2 R52.2 R54.2 R60.1 ; also on sheet 6
VDD_GPU: C94.2 C97.1 C97.2 C98.1 L3.1 R53.1 R53.2 U5.8(FB2) ; also on sheet 10
VDD_LOGIC: C81.1 C81.2 C82.2 C84.1 L1.1 R50.1 R50.2 U5.13(FB1) ; also on sheet 10
VDD_NPU: C83.2 C85.1 C86.1 C86.2 L2.2 R51.1 R51.2 U5.64(FB4) ; also on sheet 10
VDDA0V9_IMAGE: C74.1 C119.2 L11.1 U5.23(LDO1) ; also on sheet 3
VDDA0V9_PMU: C78.1 U5.20(LDO3) ; also on sheet 8
VDDA_0V9: C77.1 C111.2 L7.1 U5.21(LDO2) ; also on sheet 8 9
DDR_A0_A: U6.H2(CA0_A) ; also on sheet 7
DDR_A0_B: U6.R2(CA0_B) ; also on sheet 7
DDR_A1_A: U6.J2(CA1_A) ; also on sheet 7
DDR_A1_B: U6.P2(CA1_B) ; also on sheet 7
DDR_A2_A: U6.H9(CA2_A) ; also on sheet 7
DDR_A2_B: U6.R9(CA2_B) ; also on sheet 7
DDR_A3_A: U6.H10(CA3_A) ; also on sheet 7
DDR_A3_B: U6.R10(CA3_B) ; also on sheet 7
DDR_A4_A: U6.H11(CA4_A) ; also on sheet 7
DDR_A4_B: U6.R11(CA4_B) ; also on sheet 7
DDR_A5_A: U6.J11(CA5_A) ; also on sheet 7
DDR_A5_B: U6.P11(CA5_B) ; also on sheet 7
DDR_A_CKE0: U6.J4(CKE0_A) ; also on sheet 7
DDR_A_CKE1: U6.J5(CKE1_A) ; also on sheet 7
DDR_A_CLKN: U6.J9(CK_c_A) ; also on sheet 7
DDR_A_CLKP: U6.J8(CK_t_A) ; also on sheet 7
DDR_A_CS0: U6.H4(CS0_A) ; also on sheet 7
DDR_A_CS1: U6.H3(CS1_A) ; also on sheet 7
DDR_A_DQS0N: U6.E3(DQS0_c_A) ; also on sheet 7
DDR_A_DQS0P: U6.D3(DQS0_t_A) ; also on sheet 7
DDR_A_DQS1N: U6.E10(DQS1_c_A) ; also on sheet 7
DDR_A_DQS1P: U6.D10(DQS1_t_A) ; also on sheet 7
DDR_A_ODTCA: U6.G2(ODT_CA_A) ; also on sheet 7
DDR_B_CKE0: U6.P4(CKE0_B) ; also on sheet 7
DDR_B_CKE1: U6.P5(CKE1_B) ; also on sheet 7
DDR_B_CLKN: U6.P9(CK_c_B) ; also on sheet 7
DDR_B_CLKP: U6.P8(CK_t_B) ; also on sheet 7
DDR_B_CS0: U6.R4(CS0_B) ; also on sheet 7
DDR_B_CS1: U6.R3(CS1_B) ; also on sheet 7
DDR_B_DQS0N: U6.V3(DQS0_c_B) ; also on sheet 7
DDR_B_DQS0P: U6.W3(DQS0_t_B) ; also on sheet 7
DDR_B_DQS1N: U6.V10(DQS1_c_B) ; also on sheet 7
DDR_B_DQS1P: U6.W10(DQS1_t_B) ; also on sheet 7
DDR_B_ODTCA: U6.T2(ODT_CA_B) ; also on sheet 7
DDR_DM0_A: U6.C3(DMI0_A) ; also on sheet 7
DDR_DM0_B: U6.Y3(DMI0_B) ; also on sheet 7
DDR_DM1_A: U6.C10(DMI1_A) ; also on sheet 7
DDR_DM1_B: U6.Y10(DMI1_B) ; also on sheet 7
DDR_DQ0_A: U6.B2(DQ0_A) ; also on sheet 7
DDR_DQ0_B: U6.AA2(DQ0_B) ; also on sheet 7
DDR_DQ1_A: U6.C2(DQ1_A) ; also on sheet 7
DDR_DQ1_B: U6.Y2(DQ1_B) ; also on sheet 7
DDR_DQ2_A: U6.E2(DQ2_A) ; also on sheet 7
DDR_DQ2_B: U6.V2(DQ2_B) ; also on sheet 7
DDR_DQ3_A: U6.F2(DQ3_A) ; also on sheet 7
DDR_DQ3_B: U6.U2(DQ3_B) ; also on sheet 7
DDR_DQ4_A: U6.F4(DQ4_A) ; also on sheet 7
DDR_DQ4_B: U6.U4(DQ4_B) ; also on sheet 7
DDR_DQ5_A: U6.E4(DQ5_A) ; also on sheet 7
DDR_DQ5_B: U6.V4(DQ5_B) ; also on sheet 7
DDR_DQ6_A: U6.C4(DQ6_A) ; also on sheet 7
DDR_DQ6_B: U6.Y4(DQ6_B) ; also on sheet 7
DDR_DQ7_A: U6.B4(DQ7_A) ; also on sheet 7
DDR_DQ7_B: U6.AA4(DQ7_B) ; also on sheet 7
DDR_DQ8_A: U6.B11(DQ8_A) ; also on sheet 7
DDR_DQ8_B: U6.AA11(DQ8_B) ; also on sheet 7
DDR_DQ9_A: U6.C11(DQ9_A) ; also on sheet 7
DDR_DQ9_B: U6.Y11(DQ9_B) ; also on sheet 7
DDR_DQ10_A: U6.E11(DQ10_A) ; also on sheet 7
DDR_DQ10_B: U6.V11(DQ10_B) ; also on sheet 7
DDR_DQ11_A: U6.F11(DQ11_A) ; also on sheet 7
DDR_DQ11_B: U6.U11(DQ11_B) ; also on sheet 7
DDR_DQ12_A: U6.F9(DQ12_A) ; also on sheet 7
DDR_DQ12_B: U6.U9(DQ12_B) ; also on sheet 7
DDR_DQ13_A: U6.E9(DQ13_A) ; also on sheet 7
DDR_DQ13_B: U6.V9(DQ13_B) ; also on sheet 7
DDR_DQ14_A: U6.C9(DQ14_A) ; also on sheet 7
DDR_DQ14_B: U6.Y9(DQ14_B) ; also on sheet 7
DDR_DQ15_A: U6.B9(DQ15_A) ; also on sheet 7
DDR_DQ15_B: U6.AA9(DQ15_B) ; also on sheet 7
DDR_RESET: U6.T11(RESET_n) ; also on sheet 7
EMMC_CLKOUT/FLASH_DQS: R10.2 ; also on sheet 2
EMMC_CMD/FLASH_WRN: U4.B22(GPIO1_C4_U) ; also on sheet 2
EMMC_D0/FLASH_D0: R9.1 U4.A24(GPIO1_B4_U) ; also on sheet 2
EMMC_D1/FLASH_D1: U4.C21(GPIO1_B5_U) ; also on sheet 2
EMMC_D2/FLASH_D2: U4.B24(GPIO1_B6_U) ; also on sheet 2
EMMC_D3/FLASH_D3: U4.D21(GPIO1_B7_U) ; also on sheet 2
EMMC_D4/FLASH_D4: U4.A25(GPIO1_C0_U) ; also on sheet 2
EMMC_D5/FLASH_D5: U4.E21(GPIO1_C1_U) ; also on sheet 2
EMMC_D6/FLASH_D6: U4.E22(GPIO1_C2_U) ; also on sheet 2
EMMC_D7/FLASH_D7: U4.B25(GPIO1_C3_U) ; also on sheet 2
EMMC_DATA_STROBE/FLASH_CLE: U4.A26(GPIO1_C6_D) ; also on sheet 2
EMMC_RSTN/FSPI_D2/FLASH_WPN: U4.F20(GPIO1_C7_D) ; also on sheet 2
GMAC0_RSTN_GPIO3_B7: U4.AD4(GPIO3_B7_D)
GMAC1_INT/PMEB_GPIO3_A7: U4.AH2(GPIO3_A7_D)
GMAC1_MCLKINOUT_M1: U4.U2(GPIO4_C1_D)
GMAC1_MDC_M0: U4.AC3(GPIO3_C4_D)
GMAC1_RSTN_GPIO3_B0: U4.AG2(GPIO3_B0_D)
GMAC1_RXCLK_M1: U4.Y3(GPIO4_A3_D)
GMAC1_RXD2_M1: U4.AA2(GPIO4_A1_D)
GMAC1_RXD3_M1: U4.Y4(GPIO4_A2_D)
GPIO3_B5: U4.AE2(GPIO3_B5_D) ; also on sheet 11
GPIO3_B6: U4.AE3(GPIO3_B6_D)
GPIO3_C0: U4.AD2(GPIO3_C0_D) ; also on sheet 11
GPIO3_C5: U4.AC2(GPIO3_C5_D) ; also on sheet 11
GPIO3_D1: U4.AB1(GPIO3_D1_D) ; also on sheet 11
GPIO3_D2: U4.Y7(GPIO3_D2_D)
GPIO3_D3: U4.AC1(GPIO3_D3_D) ; also on sheet 11
GPIO3_D4: U4.AA1(GPIO3_D4_D) ; also on sheet 11
GPIO3_D5: U4.AA5(GPIO3_D5_D) ; also on sheet 11
GPIO4_A4_D: U4.Y2(GPIO4_A4_D) ; also on sheet 11
GPIO4_A5_D: U4.Y1(GPIO4_A5_D) ; also on sheet 11
GPIO4_A6_D: U4.W2(GPIO4_A6_D) ; also on sheet 11
GPIO4_A7_D: U4.W1(GPIO4_A7_D) ; also on sheet 11
GPIO4_B0_D: U4.V7(GPIO4_B0_D)
GPIO4_B1_D: U4.V2(GPIO4_B1_D)
GPIO4_B2_D: U4.V4(GPIO4_B2_D)
GPIO4_B3_D: R171.1 U4.V1(GPIO4_B3_D) ; also on sheet 11
GPIO4_B6_D: U4.U5(GPIO4_B6_D)
GPIO4_B7_D: U4.U4(GPIO4_B7_D)
GPIO4_C0_D: U4.U3(GPIO4_C0_D)
HDMIRX_DET_L_GPIO3_D0: U4.AB5(GPIO3_D0_D)
HP_DET_L_GPIO3_C2: U4.AA7(GPIO3_C2_D)
HP_L: U5.39(HPL_OUT)
HP_R: U5.41(HPR_OUT)
HP_SNS: U5.40(HP_SNS)
I2C0_SCL_PMIC: U5.1(SCL) ; also on sheet 8 12
I2C0_SDA_PMIC: U5.2(SDA) ; also on sheet 8 12
I2C5_SCL_M0: U4.AF1(GPIO3_B3_D) ; also on sheet 11
I2C5_SDA_M0: U4.AE1(GPIO3_B4_D) ; also on sheet 11
I2S1_LRCK_TX_M0_RK809: U5.14(LRCLK) ; also on sheet 5
I2S1_MCLK_M0_RK809: U5.16(MCLK) ; also on sheet 5
I2S1_SCLK_TX_M0_RK809: U5.15(BCLK) ; also on sheet 5
I2S1_SDI0_M0/PDM_SDI0_M0_RK809: U5.18(SDO/PDMDATA) ; also on sheet 5
I2S1_SDO0_M0_RK809: U5.17(SDI) ; also on sheet 5
I2S3_MCLK_M0: U4.AE5(GPIO3_A2_D)
I2S3_SDI_M0: U4.AG3(GPIO3_A6_D)
I2S3_SDO_M0: U4.AH3(GPIO3_A5_D)
LCD_EN_H_GPIO3_C6: U4.AC5(GPIO3_C6_D)
LCD_RST_L_GPIO3_C7: U4.AA6(GPIO3_C7_D)
MIC1_INN: C129.2 ; also on sheet 11
MIC1_INP: C123.2 ; also on sheet 11
MIPI_AVDD_0V9: L11.2 ; also on sheet 3 4
MIPI_AVDD_1V8: L12.2 ; also on sheet 3 4
NRST: R4.1 TP4.1 U9.38(NRST)
PA0: U9.33(PA0/FCC_IN) ; also on sheet 11
PA1: U9.34(PA1) ; also on sheet 11
PA2/ROSC: U9.42(PA2/ROSC)
PA3/LFXIN: U9.43(PA3/LFXIN)
PA4/LFCLK_IN/LFXOUT: U9.44(PA4/LFCLK_IN/LFXOUT)
PA5/HFXIN/FCC_IN: C4.1 U9.45(PA5/HFXIN/FCC_IN) X3.1
PA6/HFCLK_IN/HFXOUT: C5.2 U9.46(PA6/HFCLK_IN/HFXOUT) X3.3
PA7: U9.49(PA7/CLK_OUT) ; also on sheet 11
PA8: U9.54(PA8)
PA9/RTC_OUT/CLK_OUT: U9.55(PA9/RTC_OUT/CLK_OUT)
PA10/CLK_OUT: U9.56(PA10/CLK_OUT)
PA11: U9.57(PA11)
PA12/FCC_IN: U9.5(PA12/FCC_IN)
PA13: U4.AF2(GPIO3_B2_D) U9.6(PA13)
PA14: U4.AG1(GPIO3_B1_D) U9.7(PA14/CLK_OUT/A0_12)
PA15/A1_0: U9.8(PA15/A1_0)
PA16/A1_1/FCC_IN: U9.9(PA16/A1_1/FCC_IN)
PA17: U9.10(PA17/A1_2)
PA18: U9.11(PA18/A1_3)
PA19/SWDIO: TP1.1 U9.12(PA19/SWDIO)
PA20/SWCLK: TP2.1 U9.13(PA20/SWCLK)
PA21/A1_7/VREF-: U9.17(PA21/A1_7/VREF-)
PA22/CLK_OUT/A0_7: U9.18(PA22/CLK_OUT/A0_7)
PA23VREF+: U9.24(PA23VREF+)
PA24/A0_3: U9.25(PA24/A0_3)
PA25/A0_2: U9.26(PA25/A0_2)
PA26: U9.30(PA26/A0_1) ; also on sheet 11
PA27: U9.31(PA27/A0_0) ; also on sheet 11
PA28: U9.35(PA28) ; also on sheet 11
PA29: U9.36(PA29) ; also on sheet 11
PA30: U9.37(PA30)
PA31/CLK_OUT: U9.39(PA31/CLK_OUT)
PB0: U9.47(PB0) ; also on sheet 11
PB1: U9.48(PB1) ; also on sheet 11
PB2: U9.50(PB2) ; also on sheet 11
PB3: U9.51(PB3) ; also on sheet 11
PB4: U9.52(PB4) ; also on sheet 11
PB5: U9.53(PB5) ; also on sheet 11
PB6: U9.58(PB6)
PB7: U9.59(PB7)
PB8: U9.60(PB8)
PB9: U9.61(PB9)
PB10: U9.62(PB10)
PB11/CLK_OUT: U9.63(PB11/CLK_OUT)
PB12: U9.64(PB12)
PB13: U9.1(PB13)
PB14: U9.2(PB14)
PB15: U9.3(PB15)
PB16: U9.4(PB16)
PB17/A1_4: U9.14(PB17/A1_4)
PB18/A1_5: U9.15(PB18/A1_5)
PB19/A1_6: U9.16(PB19/A1_6)
PB20/A0_6: U9.19(PB20/A0_6)
PB21: U9.20(PB21)
PB22: U9.21(PB22)
PB23: U9.22(PB23)
PB24/A0_5: U9.23(PB24/A0_5)
PB25: U9.27(PB25/A0_4) ; also on sheet 11
PB26: U9.28(PB26) ; also on sheet 11
PB27: U9.29(PB27) ; also on sheet 11
PCIE20_CLKREQN_M1: U4.AG6(GPIO2_D0_D) ; also on sheet 11
PCIE20_PERSTN_M1: U4.AD1(GPIO3_C1_D) ; also on sheet 11
PCIE20_WAKEN_M1: U4.AD7(GPIO2_D1_D) ; also on sheet 11
PCIE30X1_CLKREQN_M1: U4.AC8(GPIO2_D2_D) ; also on sheet 11
PCIE30X1_PERSTN_M1: U4.AB8(GPIO3_A1_D) ; also on sheet 11
PCIE30X1_PRSNT_L_GPIO3_A0: U4.AH4(GPIO3_A0_D) ; also on sheet 11
PCIE30X1_WAKEN_M1: U4.AC7(GPIO2_D3_D) ; also on sheet 11
PCIE30X2_CLKREQN_M1: U4.AF5(GPIO2_D4_D) ; also on sheet 11
PCIE30X2_PERSTN_M1: U4.AD6(GPIO2_D6_D) ; also on sheet 11
PCIE30X2_PRSNT_L_GPIO2_D7: U4.AH5(GPIO2_D7_D) ; also on sheet 11
PCIE30X2_WAKEN_M1: U4.AF6(GPIO2_D5_D) ; also on sheet 11
PDM_CLK0_M0_RK809: U5.19(PDMCLK) ; also on sheet 5
PMIC_32KOUT_WIFI: R60.2 R61.1
PMIC_INT_L: U5.7(INT) ; also on sheet 8
PMIC_PWRON: C128.1 U5.52(PWRON)
PMIC_RESET_KEY: R64.1
PMIC_SLEEP_H: U5.49(SLEEP) ; also on sheet 8 12
RESETN: C127.2 R63.2 R64.2 U5.67(RESETB)
SDMMC0_CLK: R11.2 ; also on sheet 11
SDMMC0_CMD: U4.H27(GPIO2_A1_U) ; also on sheet 11
SDMMC0_D0: U4.J25(GPIO1_D5_U) ; also on sheet 11
SDMMC0_D1: U4.J24(GPIO1_D6_U) ; also on sheet 11
SDMMC0_D2: U4.H26(GPIO1_D7_U) ; also on sheet 11
SDMMC0_D3: U4.J23(GPIO2_A0_U) ; also on sheet 11
SPK_CTL_H_GPIO3_C3: U4.AC4(GPIO3_C3_D)
SPKN_OUT: C121.2 L8.2 ; also on sheet 11
SPKP_OUT: C120.2 L10.2 ; also on sheet 11
USB3_OTG0_DM: USBC1.A7(DN1) USBC1.B7(DN2) ; also on sheet 9
USB3_OTG0_DP: USBC1.A6(DP1) USBC1.B6(DP2) ; also on sheet 9
USB3_OTG0_VBUSDET: R177.2 ; also on sheet 9
USB_AVDD_0V9: L7.2 ; also on sheet 9
USB_AVDD_1V8: L9.2 ; also on sheet 9
VCORE: C55.2 U9.32(VCORE)
$22N1464: R71.1 U6.A8(ZQ1_A)
$22N1465: R72.1 U6.A5(ZQ0_A)
$23N4261: C126.2 R59.1 R62.2 U5.61(VDC)
$23N4267: R55.2 R56.2 U5.27(FB3)
$23N4303: C117.2 U5.48(VCC_1P8D)
$23N4304: C118.2 U5.44(VCC_1P8A)
$23N4312: C125.2 C129.1 U5.42(MIC1n)
$23N4313: C123.1 C124.2 U5.43(MIC1p)
$23N4324: L10.1 U5.32(SPK_OUTp)
$23N4327: L8.1 U5.34(SPK_OUTn)
$23N4340: R57.1 R58.1 U5.59(FB5)
$23N4341: L5.1 U5.53(SW5)
$23N4368: C109.2 U5.37(CPp)
$23N4369: C113.2 U5.38(VCC_CPVDD)
$23N4370: C114.2 U5.35(VCC_CPVSS)
$23N4372: C108.2 L6.2 U5.33(VCC_SPK_HP)
$23N4373: C109.1 U5.36(CPn)
$23N4375: L4.1 U5.25(SW3)
$23N4377: L2.1 U5.65(SW4)
$23N4396: C112.2 U5.50(XIN) X1.2
$23N4405: R61.2 U5.68(CLK32K)
$23N4407: C116.1 U5.51(XOUT) X1.1
$23N4412: L1.2 U5.12(SW1)
$23N4415: L3.2 U5.9(SW2)
$23N4418: C106.2 U5.46(VREF)
$24N1134: MR.1 R9.2
$24N1222: R10.1 U4.A23(GPIO1_C5_D)
$24N1325: R11.1 U4.H28(GPIO2_A2_D)
$28N400: R29.1 USBC1.B5(CC2)
$28N401: R30.1 USBC1.A5(CC1)
$28N405: LED1.2(A) R31.1
$28N1612: C337.1 L18.1 U26.6(LX)
$28N1614: C337.2 U26.1(BS)
$28N1617: C336.2 R164.2 R166.1 U26.4(EN)
$28N1620: C338.1 R167.2 R168.1 U26.3(FB)

Not connected (* = marked no-connect by the designer): D1 1(A) 2(A) 3(K); U4 A22(GPIO1_D0_D)* A27(GPIO1_D4_U)* AA3(GPIO4_A0_D) AF4(GPIO3_A4_D) AG4(GPIO3_A3_D) C23(GPIO1_D3_U)* C24(GPIO1_D1_U)* D23(GPIO1_D2_U)* V5(GPIO4_B5_D) V6(GPIO4_B4_D) Y5(GPIO3_D7_D) Y6(GPIO3_D6_D); U5 60(EXT_EN)*; U6 A1(DNU_1) A2(DNU_2) A11(DNU_3) A12(DNU_4) AA1(DNU_7) AA12(DNU_8) AB1(DNU_9) AB2(DNU_10) AB11(DNU_11) AB12(DNU_12) B1(DNU_5) B12(DNU_6) G11(ZQ2_A_NC)* K5(CS2_A_NC)* K8(CKE2_A_NC)* N5(CS2_B_NC)* N8(CKE2_B_NC)*; USBC1 A8(SBU1)* B8(SBU2)*

## Notes on the sheets
sheet 14
- VCCIO_WL
- The resistor parameter is 47KR ±1%
- Default:1.1V
- PMIC RK809 DCDC
- PMIC RK809 LDO
- PMIC RK809 Managerment
- PMIC RK809 CODEC
- If RK809-5 codec is not used,
  then Pin 14,15,16,17,19,40 Tie VSS
  Pin 18,36,37,38,35,39,41,34,32,43,42
  Leave floating
- 1.2V
sheet 16
- HDMI2.0
  4K@60Hz
- LPDDR4X8GB
- WIFI/BT
  AIC8800D80
- EMMC5.1
- RK3568B2
- Quad-corte Cortex-A55
- GMAC
  RTL8211F
- PMIC
  PK8.9-5
- SDMMC2.0
- PCIE3.0x1
- AUDIO
- USB3.0
sheet 17
- 预留
- 预留
- 预留
- 预留
- 预留
- 预留
sheet 18
- 后续请勿更新库，相关管脚会修改。
